# EasyEDA Pro project EtherCAT-RK3506.epro, schematic RK3506, sheets 6 to 10 of 12

## Sheets
6 RS232 RS485 CAN: Create Date: 2026-10-24; Page Name: RS232 RS485 CAN; Schematic Name: RK3506; Update Date: 2026-10-27
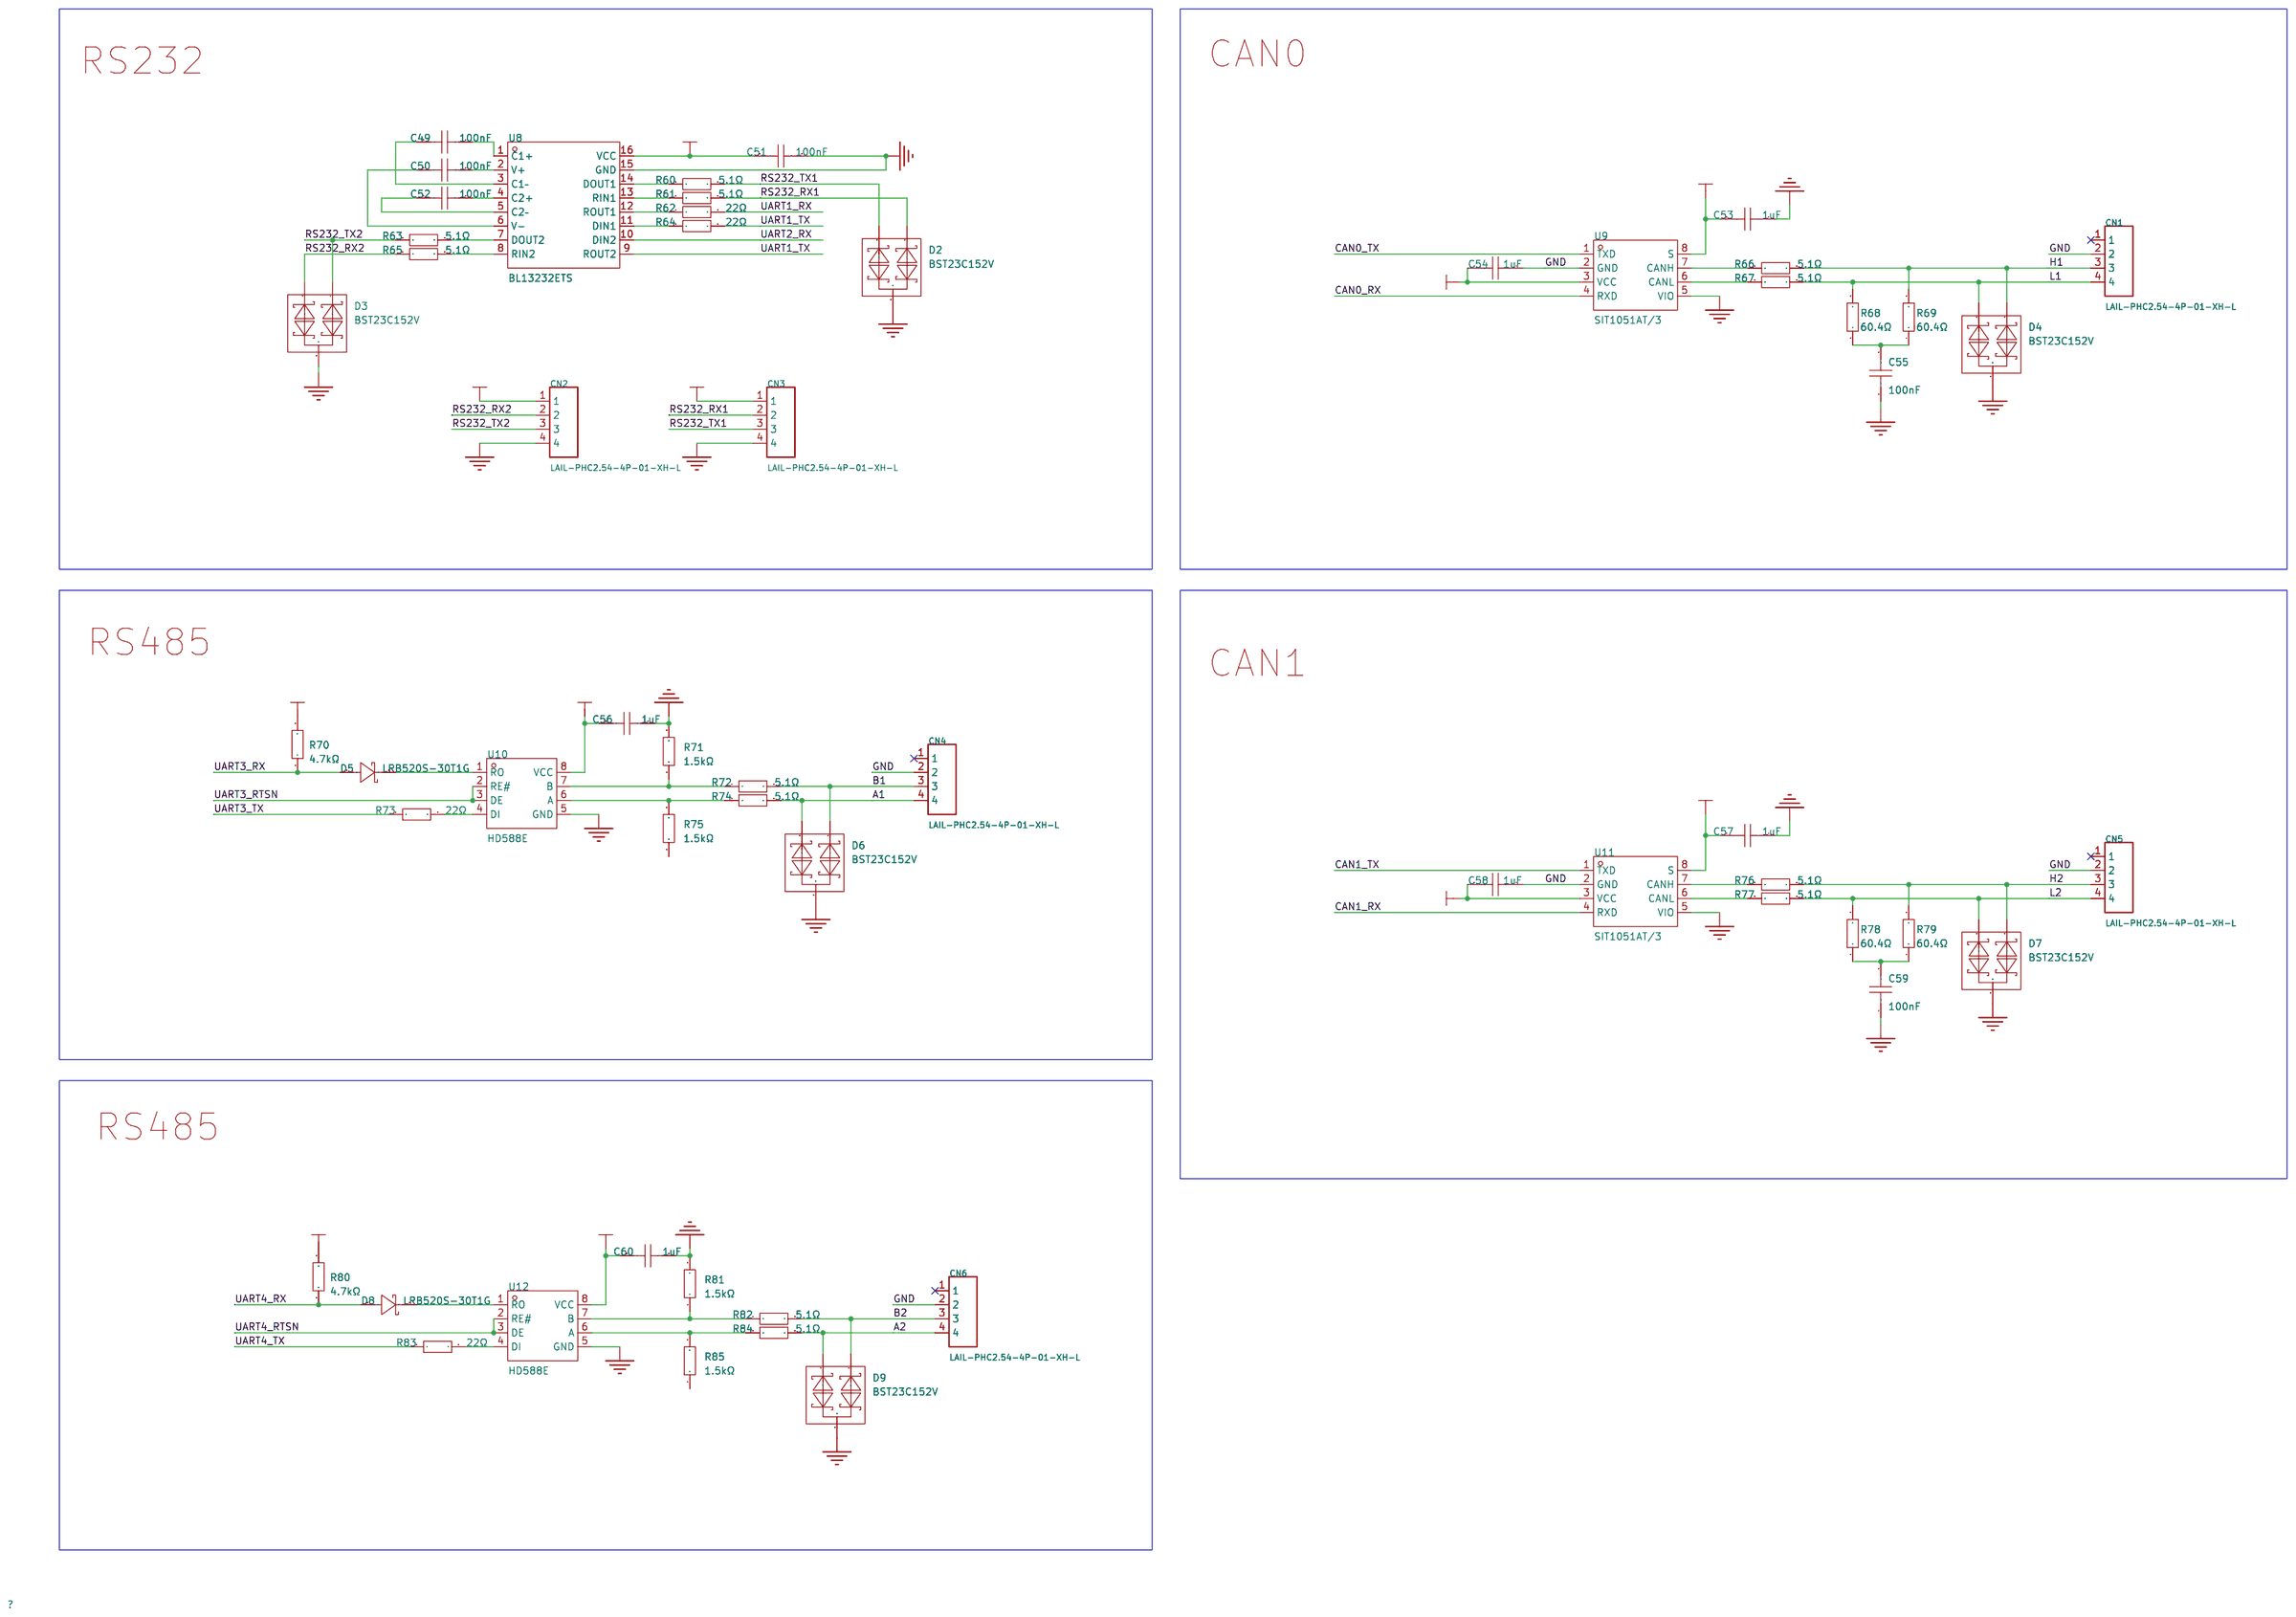
[diagram p5: RS232 RS485 CAN]
7 MIPI LCD: Create Date: 2026-10-25; Page Name: MIPI LCD; Schematic Name: RK3506; Update Date: 2026-10-26
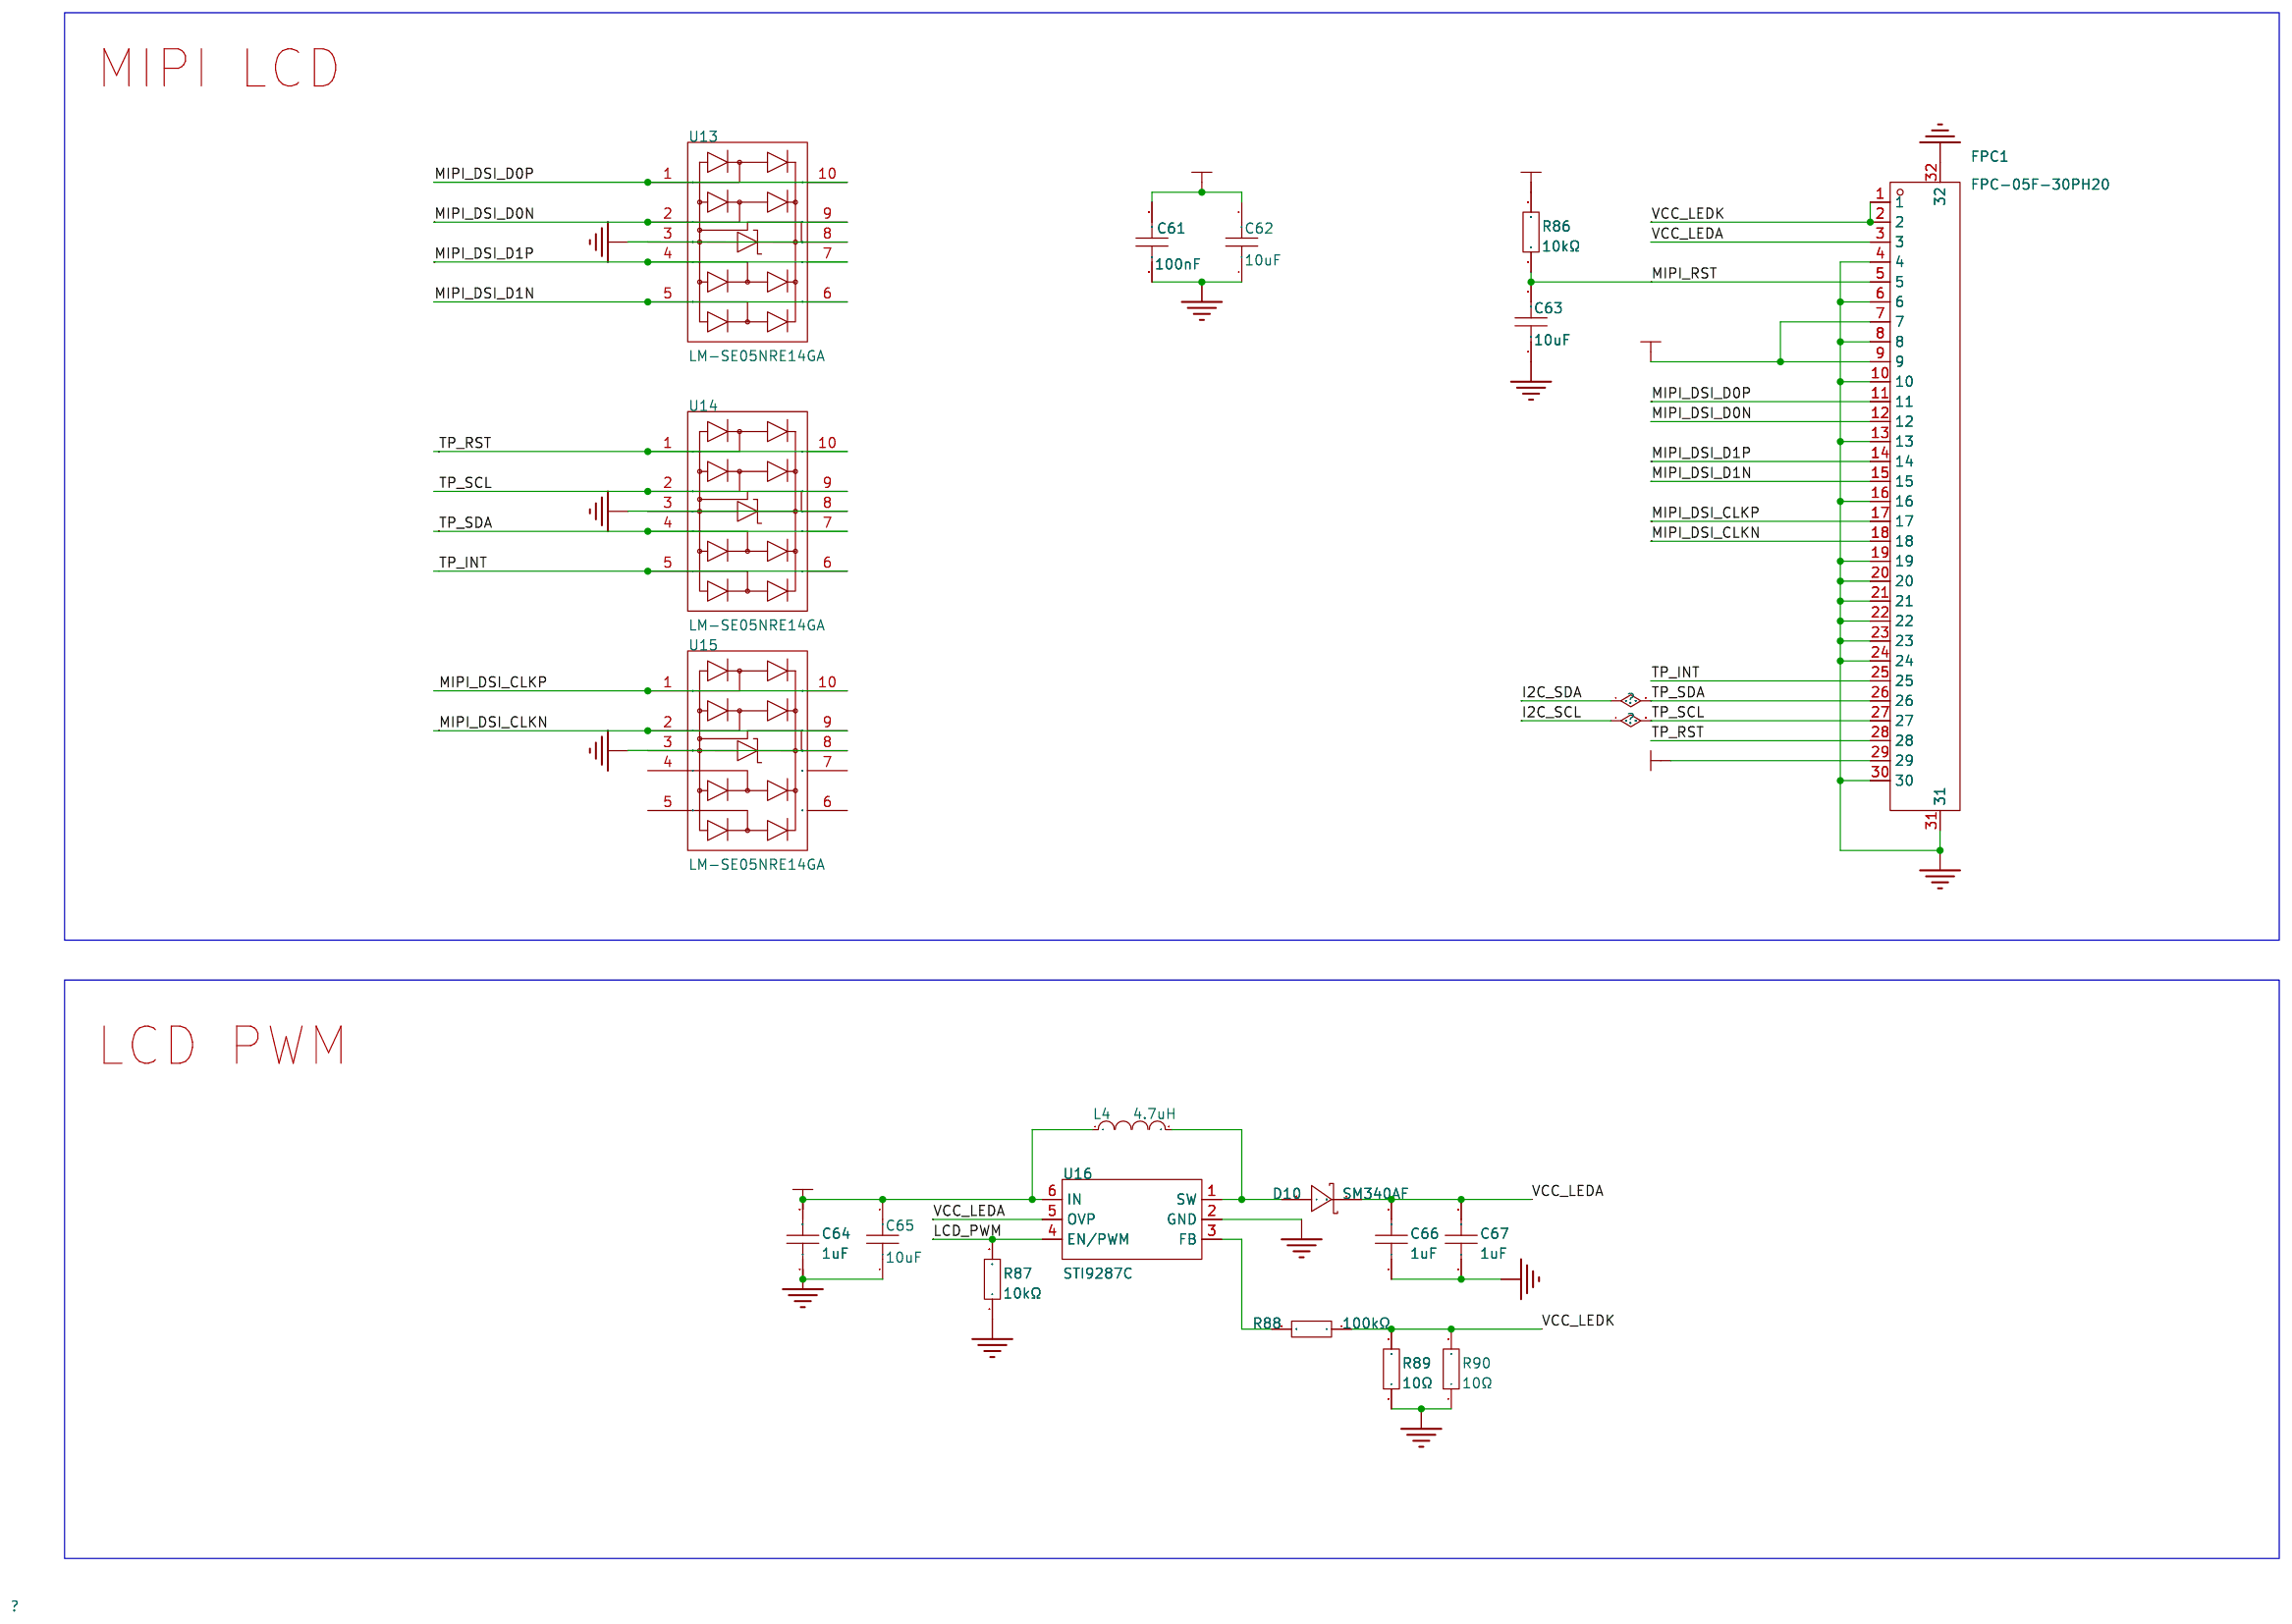
[diagram p6: MIPI LCD]
8 USB HUB: Create Date: 2026-10-25; Page Name: USB HUB; Schematic Name: RK3506; Update Date: 2026-10-28
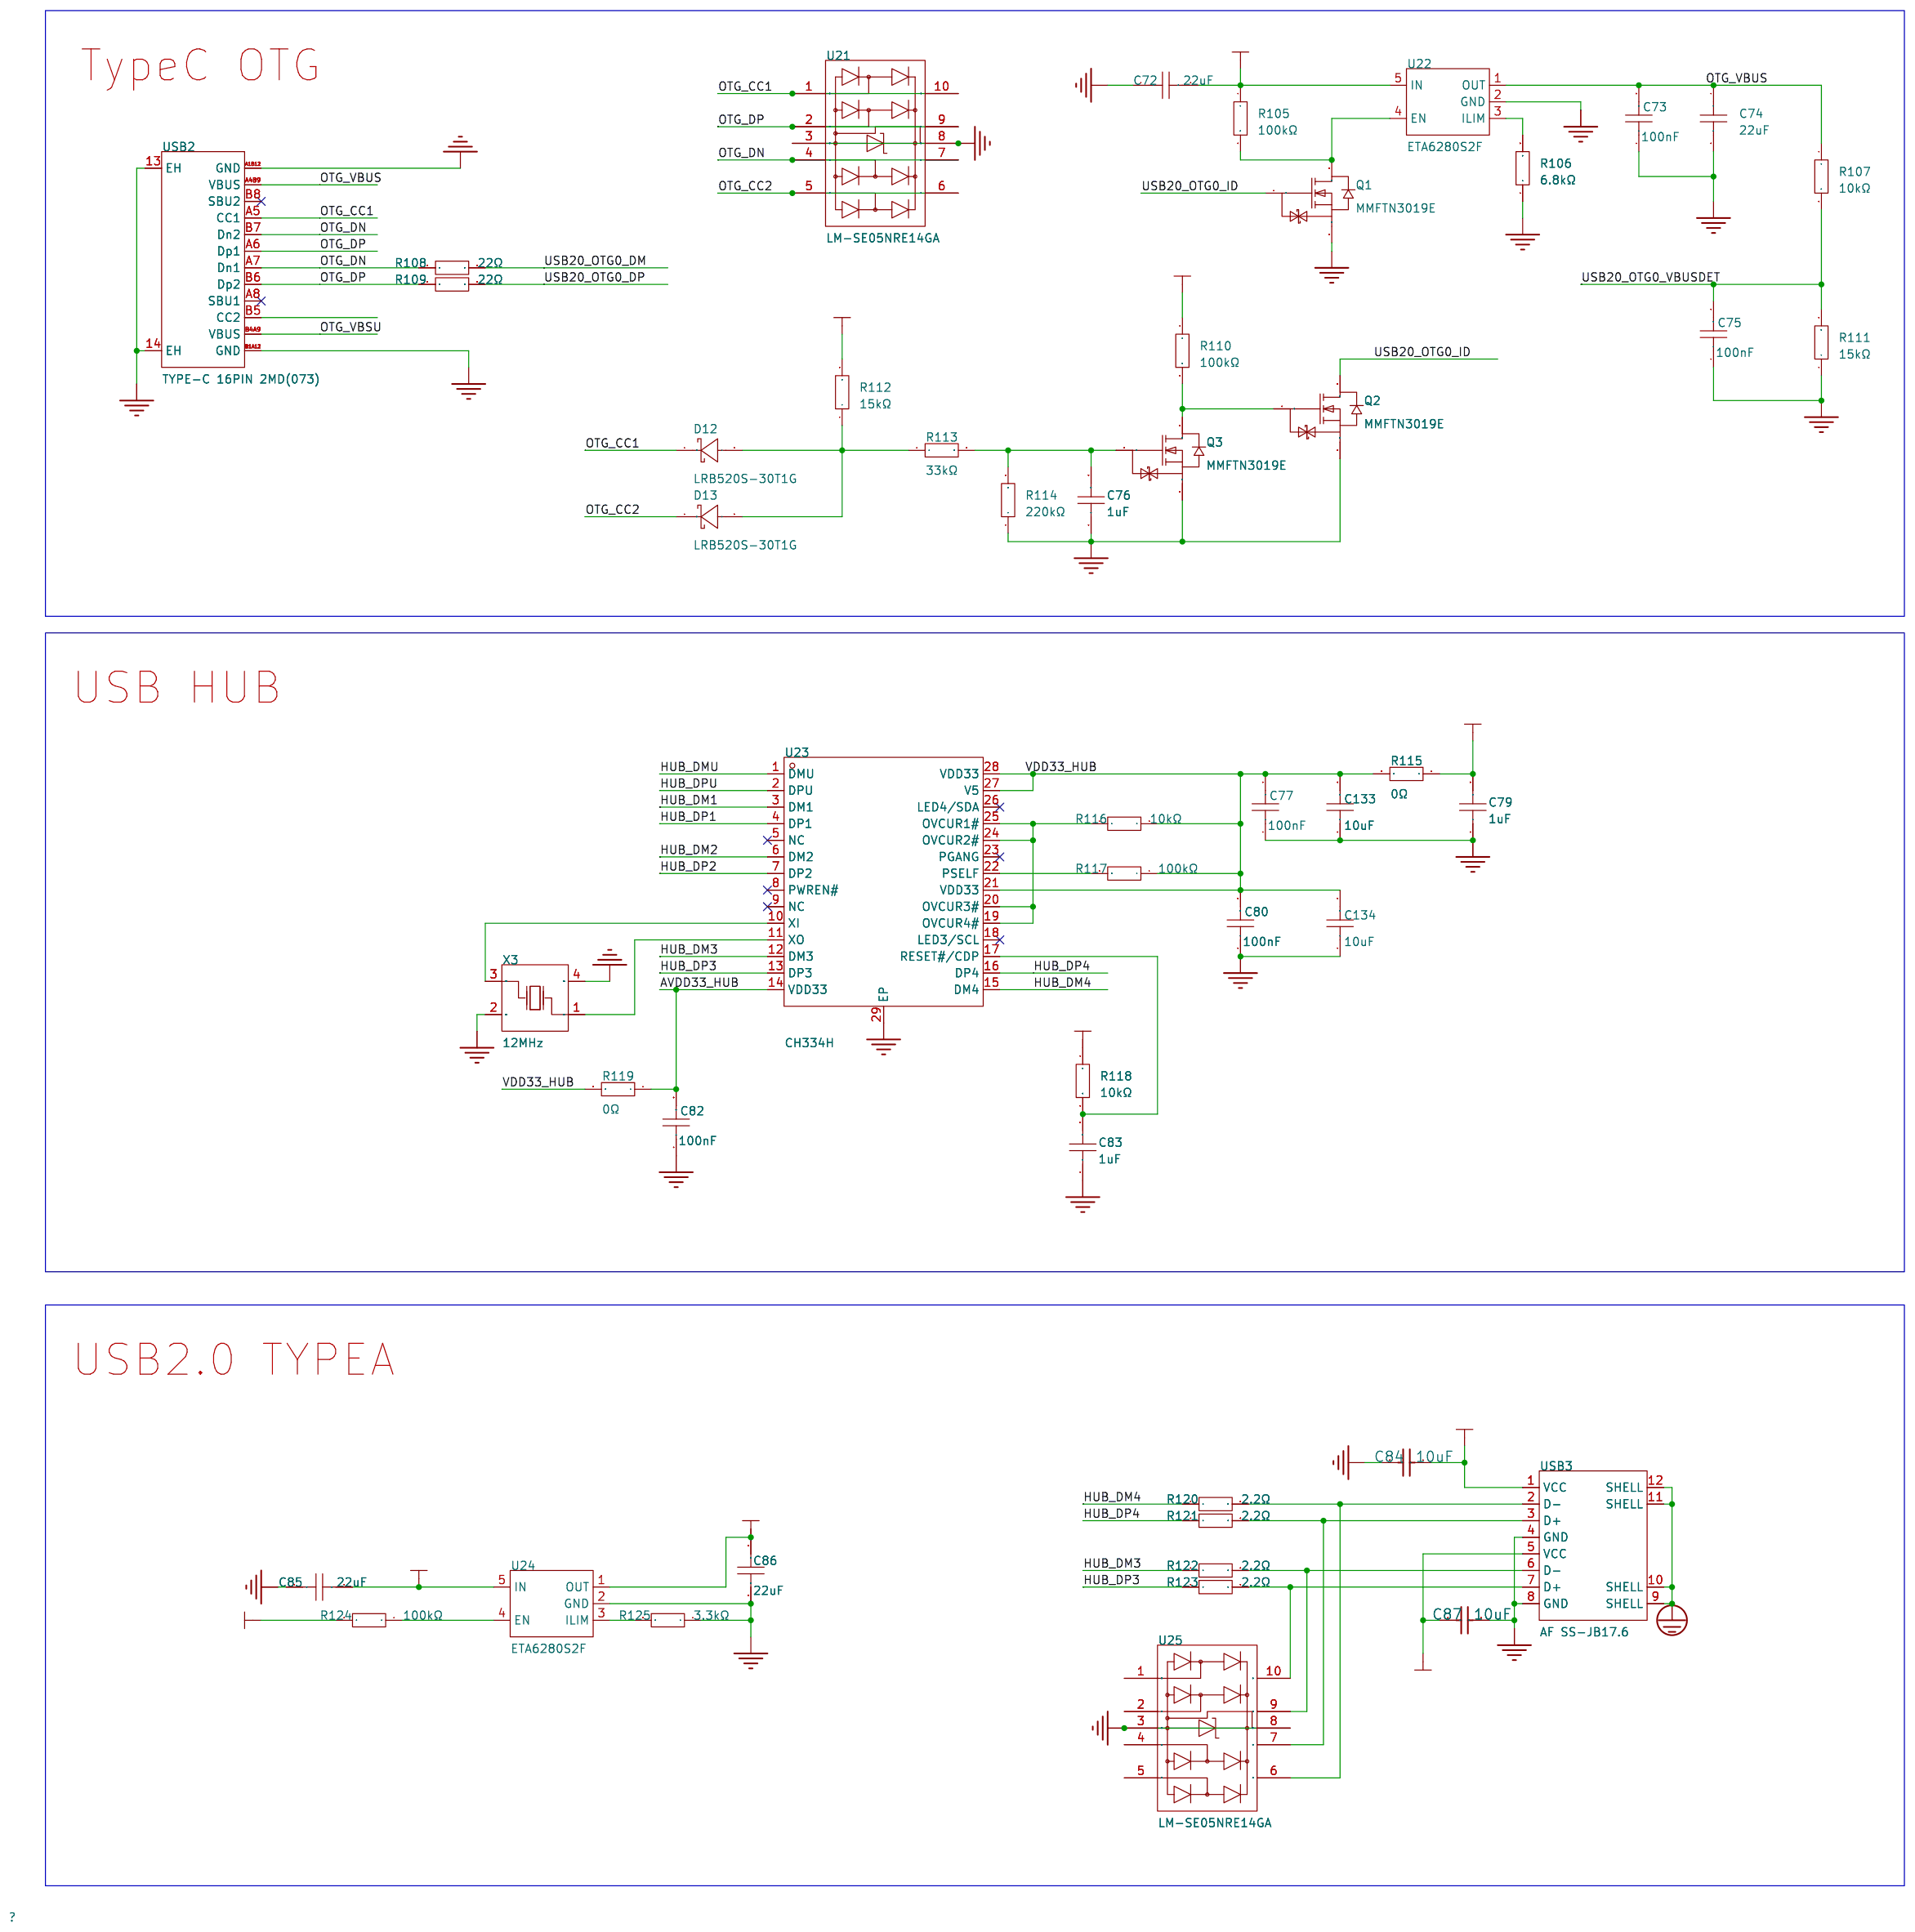
[diagram p7: USB HUB]
9 GPIO: Create Date: 2026-10-26; Page Name: GPIO; Schematic Name: RK3506; Update Date: 2026-10-27
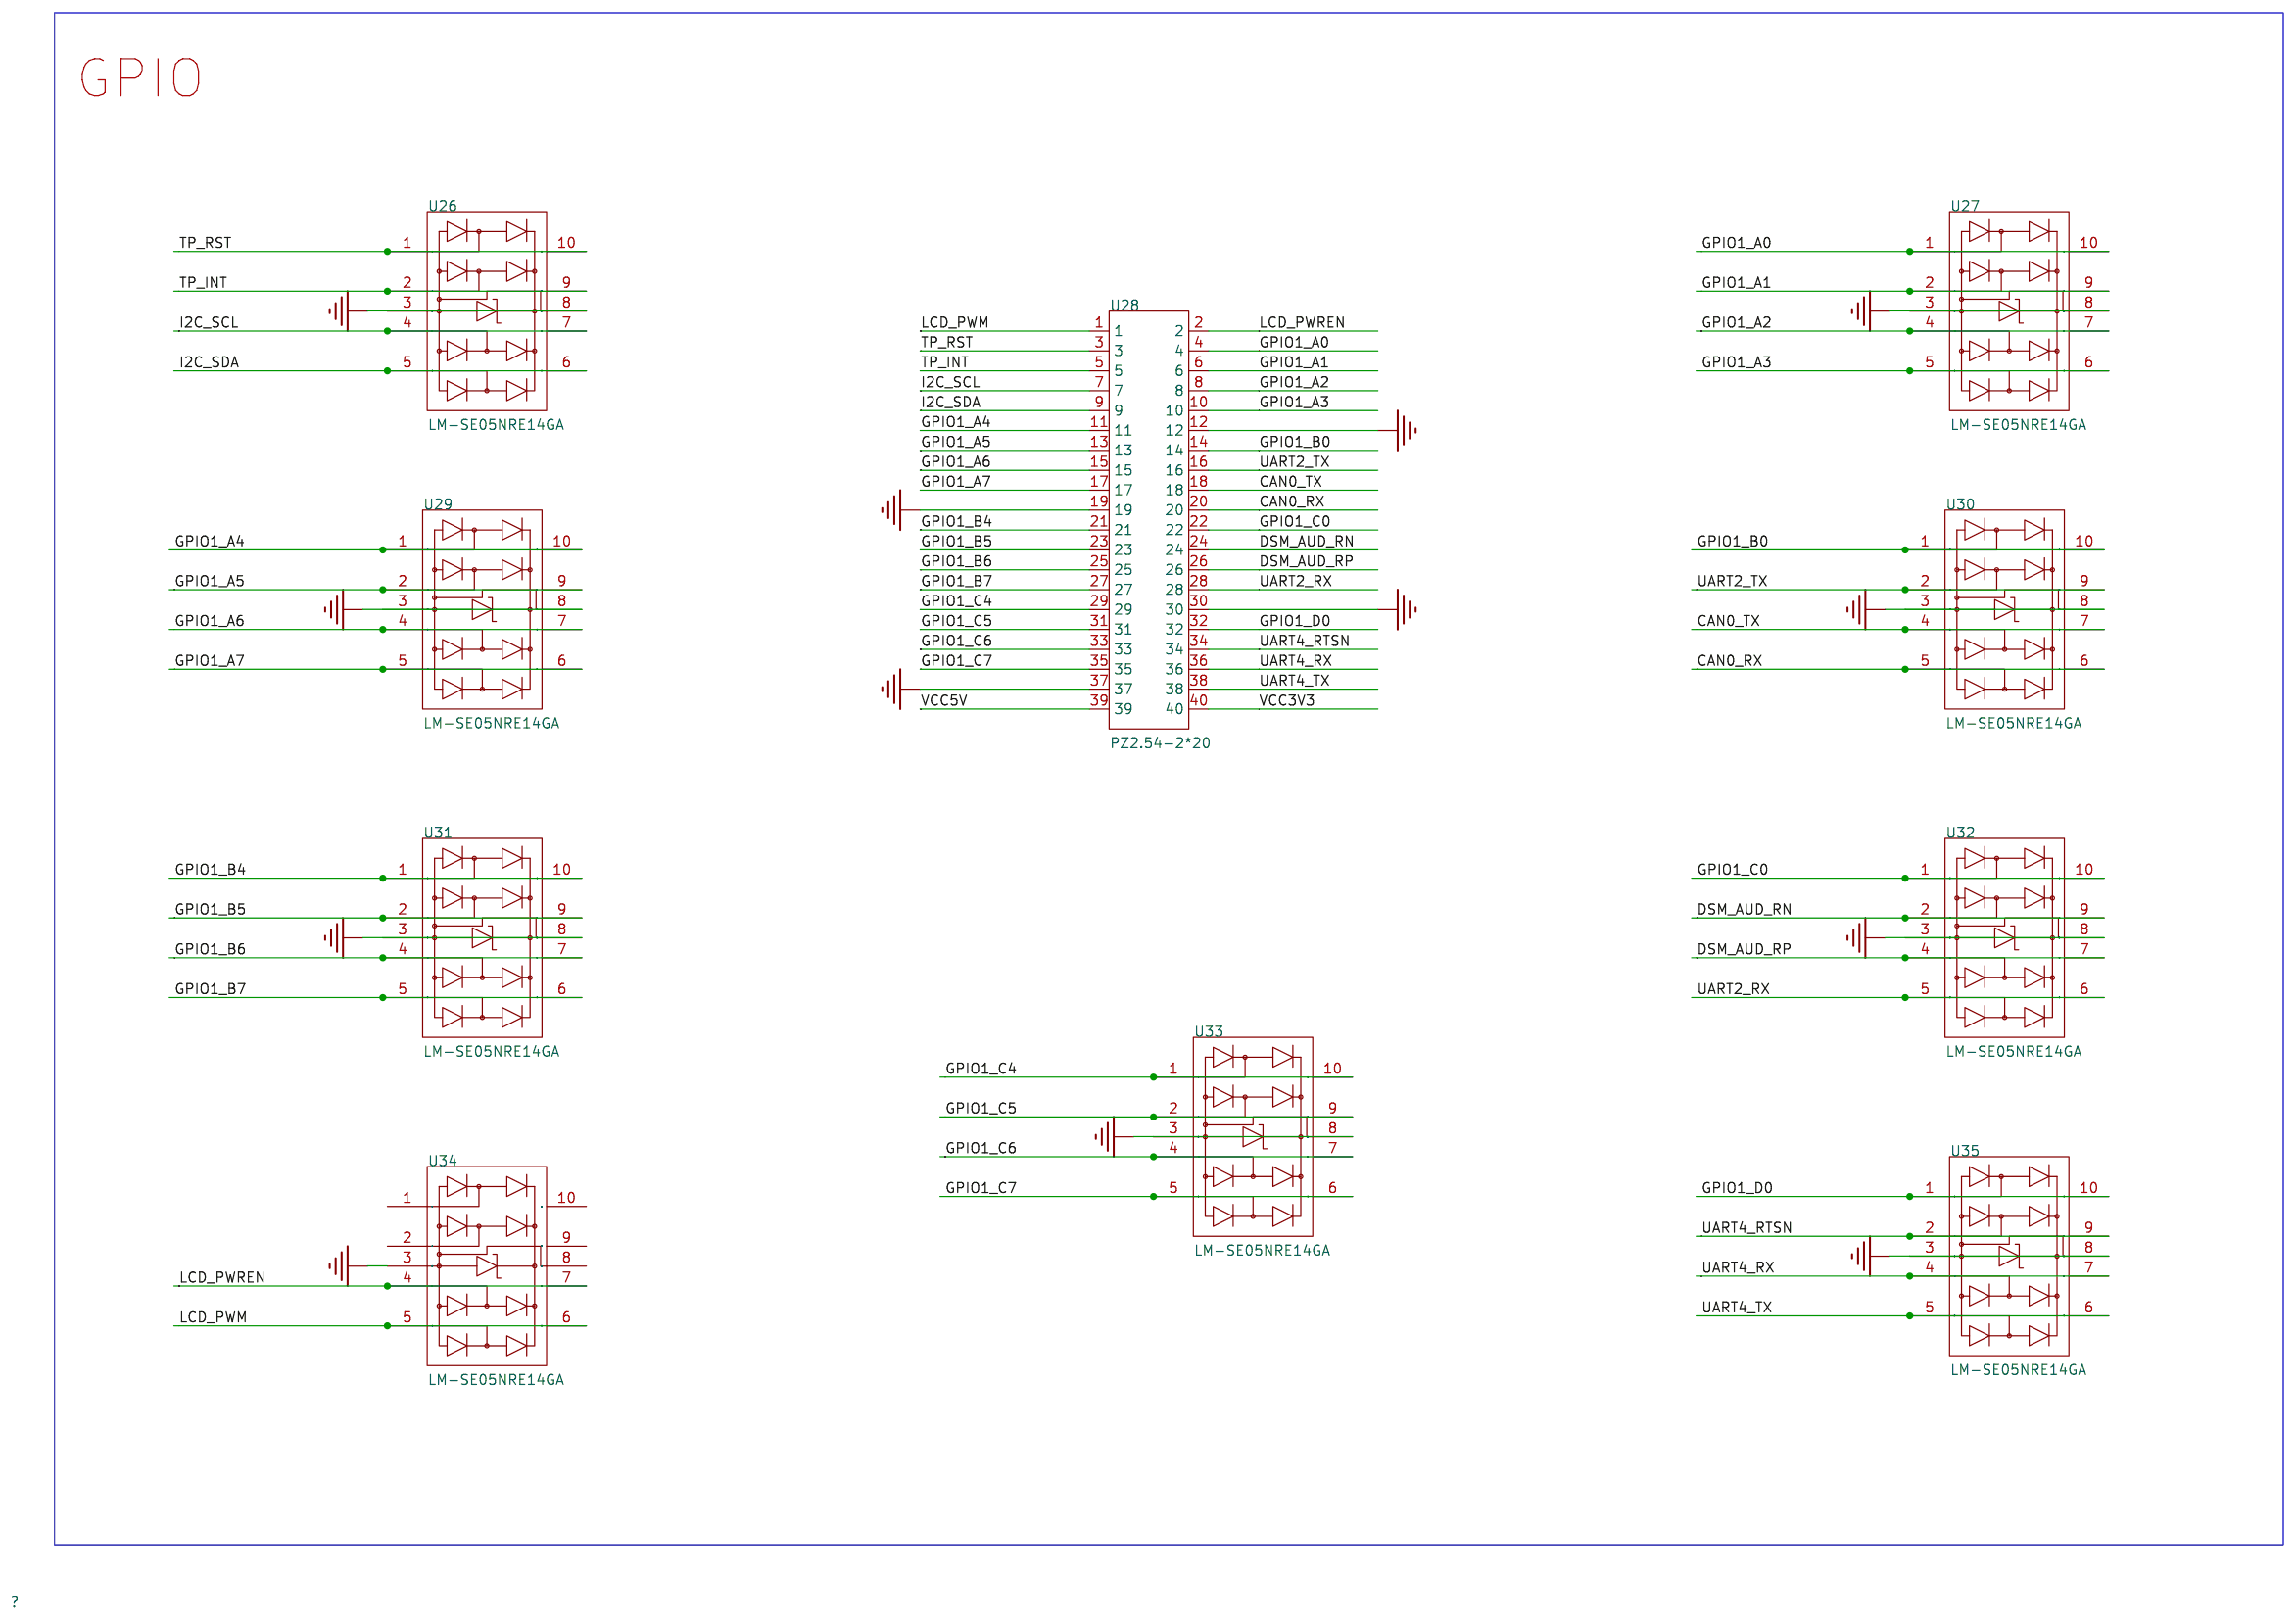
[diagram p8: GPIO]
10 Audio: Create Date: 2026-10-26; Page Name: Audio; Schematic Name: RK3506; Update Date: 2026-10-27
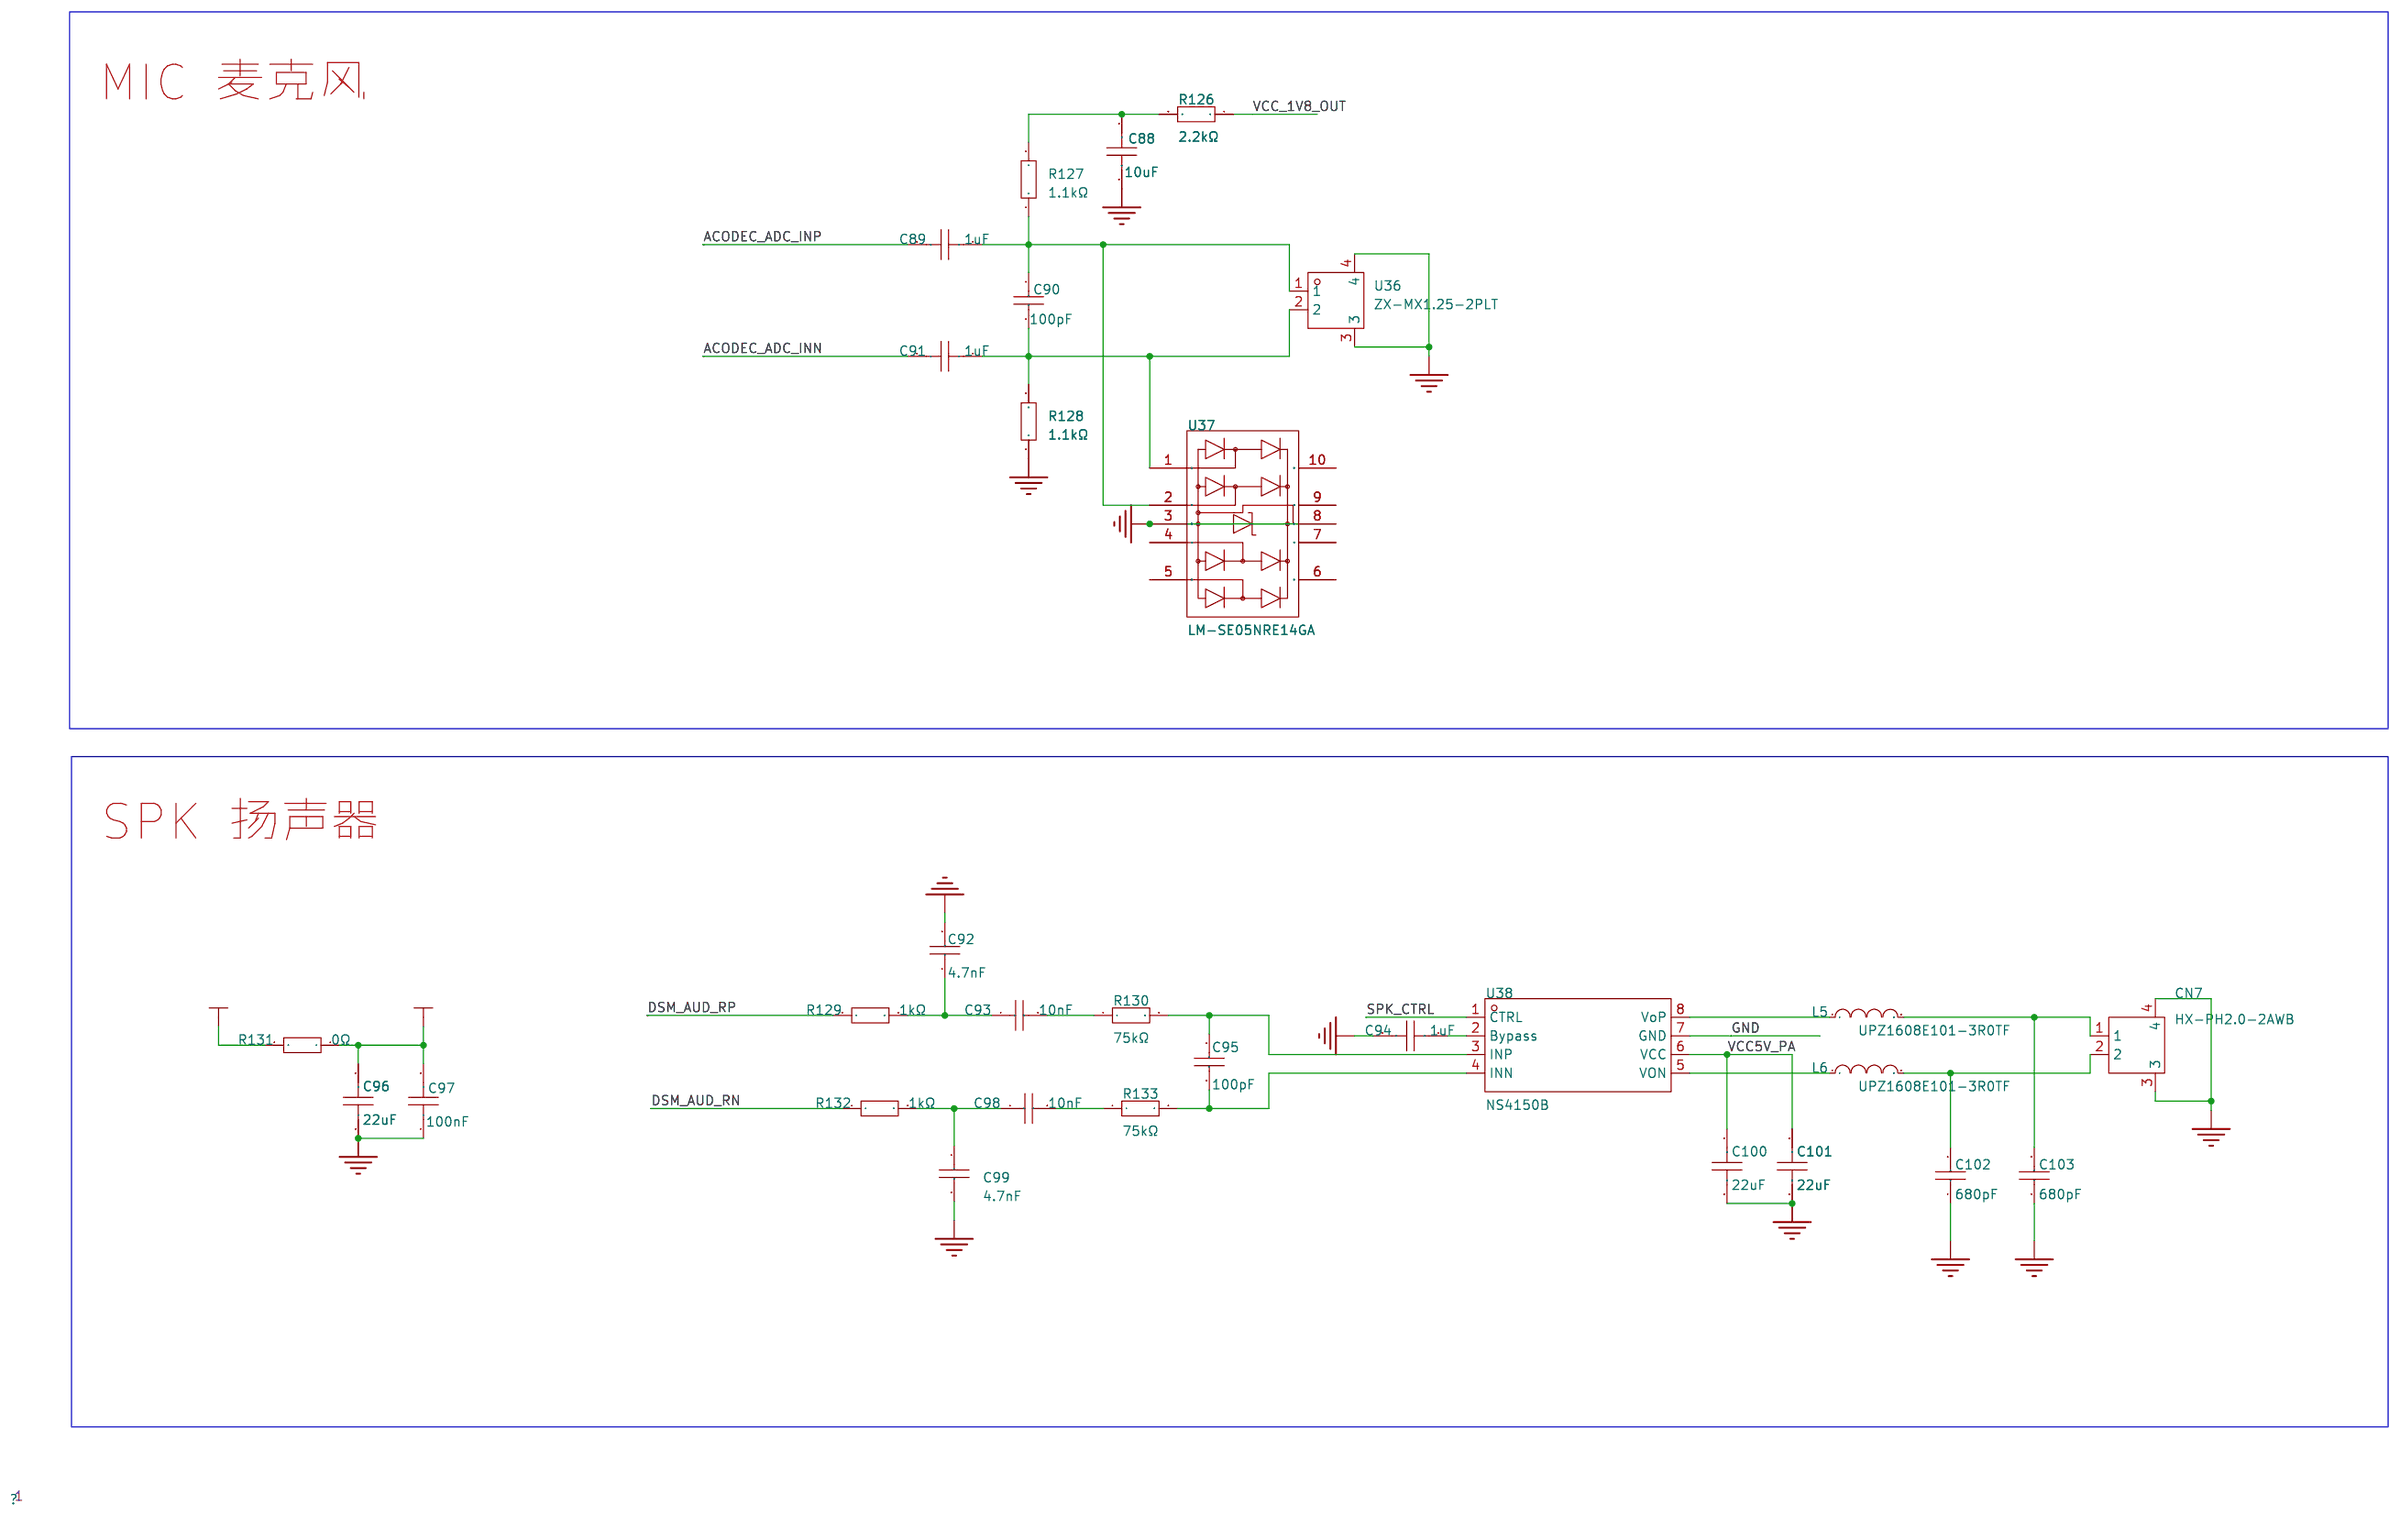
[diagram p9: Audio]

## Parts
sheet Audio
C88  10uF  [C1206]
C89  1uF  [C0402]
C90  100pF  [C0402]
C91  1uF  [C0402]
C92  4.7nF  [C0402]
C93  10nF  [C0402]
C94  1uF  [C0402]
C95  100pF  [C0402]
C96  22uF  [C0402]
C97  100nF  [C0402]
C98  10nF  [C0402]
C99  4.7nF  [C0402]
C100  22uF  [C0402]
C101  22uF  [C0402]
C102  680pF  [C0402]
C103  680pF  [C0402]
CN7  HX-PH2.0-2AWB  [CONN-SMD_2P-P2.00_HX-PH2.0-2AWB]
L5  UPZ1608E101-3R0TF  [L0603]
L6  UPZ1608E101-3R0TF  [L0603]
R126  2.2kΩ  [R0402]
R127  1.1kΩ  [R0402]
R128  1.1kΩ  [R0402]
R129  1kΩ  [R0402]
R130  75kΩ  [R0603]
R131  0Ω  [R0402]
R132  1kΩ  [R0402]
R133  75kΩ  [R0603]
U36  ZX-MX1.25-2PLT  [CONN-SMD_2P-P1.25-MX1.25-2P-LT]
U37  LM-SE05NRE14GA  [DFN2510-10_L2.5-W1.0-P0.50-BL]
U38  NS4150B  [MSOP-8_L3.0-W3.0-P0.65-LS5.0-BL]
sheet GPIO
U26  LM-SE05NRE14GA  [DFN2510-10_L2.5-W1.0-P0.50-BL]
U27  LM-SE05NRE14GA  [DFN2510-10_L2.5-W1.0-P0.50-BL]
U28  PZ2.54-2*20  [HDR-TH_40P-P2.54-V-M-R2-C20-S2.54]
U29  LM-SE05NRE14GA  [DFN2510-10_L2.5-W1.0-P0.50-BL]
U30  LM-SE05NRE14GA  [DFN2510-10_L2.5-W1.0-P0.50-BL]
U31  LM-SE05NRE14GA  [DFN2510-10_L2.5-W1.0-P0.50-BL]
U32  LM-SE05NRE14GA  [DFN2510-10_L2.5-W1.0-P0.50-BL]
U33  LM-SE05NRE14GA  [DFN2510-10_L2.5-W1.0-P0.50-BL]
U34  LM-SE05NRE14GA  [DFN2510-10_L2.5-W1.0-P0.50-BL]
U35  LM-SE05NRE14GA  [DFN2510-10_L2.5-W1.0-P0.50-BL]
sheet MIPI LCD
C61  100nF  [C0402]
C62  10uF  [C0603]
C63  10uF  [C0603]
C64  1uF  [C0402]
C65  10uF  [C0603]
C66  1uF  [C0402]
C67  1uF  [C0402]
D10  SM340AF  [SMA-FL_L3.5-W2.5-LS4.6-L-RD]
FPC1  FPC-05F-30PH20  [FPC-SMD_30P-P0.50_XUNPU_FPC-05F-30PH20]
L4  4.7uH  [IND-SMD_L2.5-W2.5]
R86  10kΩ  [R0402]
R87  10kΩ  [R0402]
R88  100kΩ  [R0402]
R89  10Ω  [R0603]
R90  10Ω  [R0603]
U13  LM-SE05NRE14GA  [DFN2510-10_L2.5-W1.0-P0.50-BL]
U14  LM-SE05NRE14GA  [DFN2510-10_L2.5-W1.0-P0.50-BL]
U15  LM-SE05NRE14GA  [DFN2510-10_L2.5-W1.0-P0.50-BL]
U16  STI9287C  [SOT-23-6_L2.9-W1.6-P0.95-LS2.8-BL]
sheet RS232 RS485 CAN
C49  100nF  [C0402]
C50  100nF  [C0402]
C51  100nF  [C0402]
C52  100nF  [C0402]
C53  1uF  [C0402]
C54  1uF  [C0402]
C55  100nF  [C0402]
C56  1uF  [C0402]
C57  1uF  [C0402]
C58  1uF  [C0402]
C59  100nF  [C0402]
C60  1uF  [C0402]
CN1  LAIL-PHC2.54-4P-01-XH-L  [CONN-TH_LAIL-PHC2.54-4P-01-XH-L]
CN2  LAIL-PHC2.54-4P-01-XH-L  [CONN-TH_LAIL-PHC2.54-4P-01-XH-L]
CN3  LAIL-PHC2.54-4P-01-XH-L  [CONN-TH_LAIL-PHC2.54-4P-01-XH-L]
CN4  LAIL-PHC2.54-4P-01-XH-L  [CONN-TH_LAIL-PHC2.54-4P-01-XH-L]
CN5  LAIL-PHC2.54-4P-01-XH-L  [CONN-TH_LAIL-PHC2.54-4P-01-XH-L]
CN6  LAIL-PHC2.54-4P-01-XH-L  [CONN-TH_LAIL-PHC2.54-4P-01-XH-L]
D2  BST23C152V  [SOT-23-3_L3.0-W1.7-P0.95-LS2.9-BR]
D3  BST23C152V  [SOT-23-3_L3.0-W1.7-P0.95-LS2.9-BR]
D4  BST23C152V  [SOT-23-3_L3.0-W1.7-P0.95-LS2.9-BR]
D5  LRB520S-30T1G  [SOD-523_L1.2-W0.8-LS1.6-RD-2]
D6  BST23C152V  [SOT-23-3_L3.0-W1.7-P0.95-LS2.9-BR]
D7  BST23C152V  [SOT-23-3_L3.0-W1.7-P0.95-LS2.9-BR]
D8  LRB520S-30T1G  [SOD-523_L1.2-W0.8-LS1.6-RD-2]
D9  BST23C152V  [SOT-23-3_L3.0-W1.7-P0.95-LS2.9-BR]
R60  5.1Ω  [R0603]
R61  5.1Ω  [R0603]
R62  22Ω  [R0402]
R63  5.1Ω  [R0603]
R64  22Ω  [R0402]
R65  5.1Ω  [R0603]
R66  5.1Ω  [R0603]
R67  5.1Ω  [R0603]
R68  60.4Ω  [R0402]
R69  60.4Ω  [R0402]
R70  4.7kΩ  [R0402]
R71  1.5kΩ  [R0402]
R72  5.1Ω  [R0603]
R73  22Ω  [R0402]
R74  5.1Ω  [R0603]
R75  1.5kΩ  [R0402]
R76  5.1Ω  [R0603]
R77  5.1Ω  [R0603]
R78  60.4Ω  [R0402]
R79  60.4Ω  [R0402]
R80  4.7kΩ  [R0402]
R81  1.5kΩ  [R0402]
R82  5.1Ω  [R0603]
R83  22Ω  [R0402]
R84  5.1Ω  [R0603]
R85  1.5kΩ  [R0402]
U8  BL13232ETS  [TSSOP-16_L5.0-W4.4-P0.65-LS6.4-BL]
U9  SIT1051AT/3  [SOP-8_L4.9-W3.9-P1.27-LS6.0-BL]
U10  HD588E  [SOP-8_L4.9-W3.9-P1.27-LS6.0-BL]
U11  SIT1051AT/3  [SOP-8_L4.9-W3.9-P1.27-LS6.0-BL]
U12  HD588E  [SOP-8_L4.9-W3.9-P1.27-LS6.0-BL]
sheet USB HUB
C72  22uF  [C0603]
C73  100nF  [C0402]
C74  22uF  [C0603]
C75  100nF  [C0402]
C76  1uF  [C0402]
C77  100nF  [C0402]
C79  1uF  [C0402]
C80  100nF  [C0402]
C82  100nF  [C0402]
C83  1uF  [C0402]
C84  10uF  [C1206]
C85  22uF  [C0603]
C86  22uF  [C0603]
C87  10uF  [C1206]
C133  10uF  [C0805]
C134  10uF  [C0805]
D12  LRB520S-30T1G  [SOD-523_L1.2-W0.8-LS1.6-RD-2]
D13  LRB520S-30T1G  [SOD-523_L1.2-W0.8-LS1.6-RD-2]
Q1  MMFTN3019E  [SOT-523-3_L1.6-W0.8-P1.00-LS1.6-BR]
Q2  MMFTN3019E  [SOT-523-3_L1.6-W0.8-P1.00-LS1.6-BR]
Q3  MMFTN3019E  [SOT-523-3_L1.6-W0.8-P1.00-LS1.6-BR]
R105  100kΩ  [R0402]
R106  6.8kΩ  [R0603]
R107  10kΩ  [R0402]
R108  22Ω  [R0402]
R109  22Ω  [R0402]
R110  100kΩ  [R0402]
R111  15kΩ  [R0402]
R112  15kΩ  [R0402]
R113  33kΩ  [R0402]
R114  220kΩ  [R0603]
R115  0Ω  [R0402]
R116  10kΩ  [R0402]
R117  100kΩ  [R0402]
R118  10kΩ  [R0402]
R119  0Ω  [R0402]
R120  2.2Ω  [R0603]
R121  2.2Ω  [R0603]
R122  2.2Ω  [R0603]
R123  2.2Ω  [R0603]
R124  100kΩ  [R0402]
R125  3.3kΩ  [R0402]
U21  LM-SE05NRE14GA  [DFN2510-10_L2.5-W1.0-P0.50-BL]
U22  ETA6280S2F  [SOT-23-5_L3.0-W1.5-P0.95-LS2.8-BL]
U23  CH334H  [QFN-28_L5.0-W5.0-P0.50-BL-EP]
U24  ETA6280S2F  [SOT-23-5_L3.0-W1.5-P0.95-LS2.8-BL]
U25  LM-SE05NRE14GA  [DFN2510-10_L2.5-W1.0-P0.50-BL]
USB2  TYPE-C 16PIN 2MD(073)  [USB-C-SMD_TYPE-C-16PIN-2MD-073]
USB3  AF SS-JB17.6  [USB-A-TH_AF-SS-JB17.6]
X3  12MHz  [CRYSTAL-SMD_4P-L3.2-W2.5-BL]

## Library data of the parts
C88 = FCC1206X106K500HT: 容值:10uF;精度:±10%;额定电压:50V;温度系数:X5R;; LCSC Part Name: 10uF ±10% 50V; Supplier Part: C7467044; Manufacturer: FOJAN(富捷); Supplier Footprint: 1206; JLCPCB Part Class: 扩展库; Datasheet: https://item.szlcsc.com/datasheet/FCC1206X106K500HT/8513631.html; Supplier: LCSC; Tolerance: ±10%; Voltage Rating: 50V; Temperature Coefficient: X5R; Operating Temperature: -55℃~+85℃
C53 C54 C56-C58 C60 C64 C66 C67 C76 C79 C83 C89 C91 C94 = CL05A105KA5NQNC: 容值:1uF;精度:±10%;额定电压:25V;温度系数:X5R;; LCSC Part Name: 1uF ±10% 25V; Supplier Part: C52923; Manufacturer: SAMSUNG(三星); Supplier Footprint: 0402; JLCPCB Part Class: 基础库; Datasheet: https://item.szlcsc.com/datasheet/CL05A105KA5NQNC/53938.html; Supplier: LCSC; Tolerance: ±10%; Voltage Rating: 25V; Temperature Coefficient: X5R
C90 C95 = 0402CG101J500NT: 容值:100pF;精度:±5%;额定电压:50V;温度系数:C0G;; LCSC Part Name: 100pF ±5% 50V; Supplier Part: C1546; Manufacturer: FH(风华); Supplier Footprint: 0402; JLCPCB Part Class: 基础库; Datasheet: https://item.szlcsc.com/datasheet/0402CG101J500NT/1898.html; Supplier: LCSC; Tolerance: ±5%; Voltage Rating: 50V; Temperature Coefficient: C0G
C92 C99 = 0402B472K500NT: 容值:4.7nF;精度:±10%;额定电压:50V;温度系数:X7R;; LCSC Part Name: 4.7nF ±10% 50V; Supplier Part: C1538; Manufacturer: FH(风华); Supplier Footprint: 0402; JLCPCB Part Class: 基础库; Datasheet: https://item.szlcsc.com/datasheet/0402B472K500NT/1890.html; Supplier: LCSC; Tolerance: ±10%; Voltage Rating: 50V; Temperature Coefficient: X7R
C93 C98 = CL05B103KB5NNNC: 容值:10nF;精度:±10%;额定电压:50V;温度系数:X7R;; LCSC Part Name: 10nF ±10% 50V; Supplier Part: C15195; Manufacturer: SAMSUNG(三星); Supplier Footprint: 0402; JLCPCB Part Class: 基础库; Datasheet: https://item.szlcsc.com/datasheet/CL05B103KB5NNNC/15869.html; Supplier: LCSC; Tolerance: ±10%; Voltage Rating: 50V; Temperature Coefficient: X7R
C96 C100 C101 = HGC0402R5226M100NTEJ: 容值:22uF;精度:±20%;额定电压:10V;温度系数:X5R;; LCSC Part Name: 22uF ±20% 10V; Supplier Part: C22367823; Manufacturer: Chinocera(华瓷); Supplier Footprint: 0402; JLCPCB Part Class: 扩展库; Datasheet: https://item.szlcsc.com/datasheet/HGC0402R5226M100NTEJ/23841128.html; Supplier: LCSC; Tolerance: ±20%; Voltage Rating: 10V; Temperature Coefficient: X5R
C49-C52 C55 C59 C61 C73 C75 C77 C80 C82 C97 = FCC0402B104K160AT: 容值:100nF;精度:±10%;额定电压:16V;温度系数:X7R;; LCSC Part Name: 100nF ±10% 16V; Supplier Part: C5137468; Manufacturer: FOJAN(富捷); Supplier Footprint: 0402; JLCPCB Part Class: 扩展库; Datasheet: https://item.szlcsc.com/datasheet/FCC0402B104K160AT/5746970.html; Supplier: LCSC; Tolerance: ±10%; Voltage Rating: 16V; Temperature Coefficient: X7R; Operating Temperature: -55℃~+125℃
C102 C103 = 0402B681K500NT: 容值:680pF;精度:±10%;额定电压:50V;温度系数:X7R;; LCSC Part Name: 680pF ±10% 50V; Supplier Part: C1541; Manufacturer: FH(风华); Supplier Footprint: 0402; JLCPCB Part Class: 扩展库; Datasheet: https://item.szlcsc.com/datasheet/0402B681K500NT/1893.html; Supplier: LCSC; Tolerance: ±10%; Voltage Rating: 50V; Temperature Coefficient: X7R
CN7 = HX-PH2.0-2AWB: 插针结构:1x2P;间距:2mm;安装方式:卧贴;参考系列:PH;总PIN数:2P;排数:1;每排PIN数:2;行距:-;额定电流:2A;触头材质:黄铜;触头镀层:锡;工作温度:-25℃~+70℃;; LCSC Part Name: 1x2P 间距:2mm 卧贴 系列:PH; Supplier Part: C52016426; Manufacturer: hanxia(韩下); Supplier Footprint: SMD,P=2mm,卧贴; JLCPCB Part Class: 扩展库; Datasheet: https://item.szlcsc.com/datasheet/HX-PH2.0-2AWB/54760471.html; Supplier: LCSC; Pins Structure: 1x2P; Pitch: 2mm; Mounting Type: 卧贴; Reference Series: PH; Number of Pins: 2P; Number of Rows: 1; Number of PINs Per Row: 2; Current Rating: 2A; Contact Material: 黄铜; Contact Plating: 锡; Operating Temperature: -25℃~+70℃; Voltage Rating: 125V; Plastic Material: LCP; Flame Retardant Rating: UL94V-0; Color: 米色; Z-Height of the Board: 5.6mm; X-Length of Bottom Edge on Board (Spacing Line): 8mm; Y-Width of Bottom Edge on Board: 8.7mm
L5 L6 = UPZ1608E101-3R0TF: 阻抗@频率:100Ω@100MHz;误差:±25%;直流电阻(DCR):30mΩ;; LCSC Part Name: 单路 0603磁珠 阻抗100Ω@100MHz; Supplier Part: C96995; Manufacturer: Sunlord(顺络); Supplier Footprint: 0603; JLCPCB Part Class: 扩展库; Datasheet: https://item.szlcsc.com/datasheet/UPZ1608E101-3R0TF/98200.html; Supplier: LCSC; Impedance @ Frequency: 100Ω@100MHz; Tolerance: ±25%; DC Resistance(DCR): 30mΩ; Current Rating: 3A; Number of Circuits: 1; Operating Temperature: -55℃~+125℃
R126 = 0402WGF2201TCE: 电阻类型:厚膜电阻;阻值:2.2kΩ;精度:±1%;功率:62.5mW;工作电压:50V;温度系数:±100ppm/℃;; LCSC Part Name: 厚膜电阻 2.2kΩ ±1%; Supplier Part: C25879; Manufacturer: UNI-ROYAL(厚声); Supplier Footprint: 0402; JLCPCB Part Class: 基础库; Datasheet: https://item.szlcsc.com/datasheet/0402WGF2201TCE/26622.html; Supplier: LCSC; Type: 厚膜电阻; Tolerance: ±1%; Power(Watts): 62.5mW; Voltage-Supply(Max): 50V; Temperature Coefficient: ±100ppm/℃; Operating Temperature: -55℃~+155℃
R127 R128 = 0402WGF1101TCE: 电阻类型:厚膜电阻;阻值:1.1kΩ;精度:±1%;功率:62.5mW;工作电压:50V;温度系数:±100ppm/℃;; LCSC Part Name: 厚膜电阻 1.1kΩ ±1%; Supplier Part: C25860; Manufacturer: UNI-ROYAL(厚声); Supplier Footprint: 0402; JLCPCB Part Class: 扩展库; Datasheet: https://item.szlcsc.com/datasheet/0402WGF1101TCE/26603.html; Supplier: LCSC; Type: 厚膜电阻; Tolerance: ±1%; Power(Watts): 62.5mW; Voltage-Supply(Max): 50V; Temperature Coefficient: ±100ppm/℃; Operating Temperature: -55℃~+155℃
R129 R132 = 0402WGF1001TCE: 电阻类型:厚膜电阻;阻值:1kΩ;精度:±1%;功率:62.5mW;工作电压:50V;温度系数:±100ppm/℃;; LCSC Part Name: 厚膜电阻 1kΩ ±1%; Supplier Part: C11702; Manufacturer: UNI-ROYAL(厚声); Supplier Footprint: 0402; JLCPCB Part Class: 基础库; Datasheet: https://item.szlcsc.com/datasheet/0402WGF1001TCE/12256.html; Supplier: LCSC; Type: 厚膜电阻; Tolerance: ±1%; Power(Watts): 62.5mW; Voltage-Supply(Max): 50V; Temperature Coefficient: ±100ppm/℃; Operating Temperature: -55℃~+155℃
R130 R133 = 0603WAF7502T5E: 电阻类型:厚膜电阻;阻值:75kΩ;精度:±1%;功率:100mW;工作电压:75V;温度系数:±100ppm/℃;; LCSC Part Name: 厚膜电阻 75kΩ ±1%; Supplier Part: C23242; Manufacturer: UNI-ROYAL(厚声); Supplier Footprint: 0603; JLCPCB Part Class: 基础库; Datasheet: https://item.szlcsc.com/datasheet/0603WAF7502T5E/23969.html; Supplier: LCSC; Type: 厚膜电阻; Tolerance: ±1%; Power(Watts): 100mW; Voltage-Supply(Max): 75V; Temperature Coefficient: ±100ppm/℃; Operating Temperature: -55℃~+155℃
R115 R119 R131 = RC0402JR-070RL: 电阻类型:厚膜电阻;阻值:0Ω;精度:±5%;功率:62.5mW;工作电压:50V;温度系数:-;; LCSC Part Name: 厚膜电阻 0Ω ±5% 62.5mW; Supplier Part: C60485; Manufacturer: YAGEO(国巨); Supplier Footprint: 0402; JLCPCB Part Class: 扩展库; Datasheet: https://item.szlcsc.com/datasheet/RC0402JR-070RL/61537.html; Supplier: LCSC; Type: 厚膜电阻; Tolerance: ±5%; Power(Watts): 62.5mW; Voltage-Supply(Max): 50V; Operating Temperature: -55℃~+155℃
U36 = ZX-MX1.25-2PLT: 插针结构:1x2P;间距:1.25mm;安装方式:立贴;参考系列:PicoBlade(MX 1.25);总PIN数:2P;排数:1;每排PIN数:2;行距:-;额定电流:1A;触头材质:黄铜;触头镀层:锡;工作温度:-25℃~+85℃;; LCSC Part Name: 1x2P 间距:1.25mm 立贴 系列:PicoBlade(MX 1.25); Supplier Part: C7430473; Manufacturer: Megastar(兆星); Supplier Footprint: SMD,P=1.25mm; JLCPCB Part Class: 扩展库; Datasheet: https://item.szlcsc.com/datasheet/ZX-MX1.25-2PLT/8430342.html; Supplier: LCSC; Pins Structure: 1x2P; Pitch: 1.25mm; Mounting Type: 立贴; Reference Series: PicoBlade(MX 1.25); Number of Pins: 2P; Number of Rows: 1; Number of PINs Per Row: 2; Current Rating: 1A; Contact Material: 黄铜; Contact Plating: 锡; Operating Temperature: -25℃~+85℃; Voltage Rating: 125V; Plastic Material: LCP; Supplementary Features: 辅助焊脚; Color: 米色; Z-Height of the Board: 4.7mm; X-Length of Bottom Edge on Board (Spacing Line): 7.5mm; Y-Width of Bottom Edge on Board: 4.3mm
U13-U15 U21 U25-U27 U29-U35 U37 = LM-SE05NRE14GA: 反向截止电压(Vrwm):5V;钳位电压:15V;击穿电压(VBR):6V;; LCSC Part Name: ESD 5V截止; Supplier Part: C5310700; Manufacturer: Leiditech(雷卯电子); Supplier Footprint: DFN2510-10; JLCPCB Part Class: 扩展库; Datasheet: https://item.szlcsc.com/datasheet/LM-SE05NRE14GA/6066343.html; Supplier: LCSC; Reverse Stand-Off Voltage (Vrwm): 5V; Clamping Voltage: 15V; Voltage - Breakdown: 6V; Reverse Leakage Current (Ir): 100nA; Number of Channels: 四路; level of protection: IEC 61000-4-5；IEC 61000-4-2; Type: ESD; Junction Capacitance: 0.3pF
U38 = NS4150B_C189961: 功放类型:D类功放;扬声器通道数:单声道;输出功率:3Wx1@4Ω;静态电流(Iq):4mA;; LCSC Part Name: 3.0W单声道D类音频功率放大器; Supplier Part: C189961; Manufacturer: Nsiway(纳芯威); Supplier Footprint: MSOP-8; JLCPCB Part Class: 扩展库; Datasheet: https://item.szlcsc.com/datasheet/NS4150B/207582.html; Supplier: LCSC; Class: D类功放; Speaker Channels: 单声道; Output Power: 3Wx1@4Ω; Total Harmonic Distortion + Noise (THD+N): 0.1%; Quiescent Current: 4mA; Power Supply Rejection Ratio (PSRR): -80dB; Efficiency: 88%；90%; Number of Inputs: 1对差分输入; Features: ESD保护；无滤波器架构；使能/关断功能；自动静音/免噪音开关; Voltage - Supply: 3V~5.25V; Operating Temperature: -40℃~+85℃
U28 = PZ2.54-2*20: 插针结构:2x20P;间距:2.54mm;行距:2.54mm;圆针/方针:方针;安装方式:直插;排数:双排;总PIN位数:40P;额定电流:2.5A;配合针长度:6mm;塑高:2.54mm;端接针长度:3mm;触头材质:黄铜;触头镀层:金;工作温度:-40℃~+105℃;; LCSC Part Name: 2x20P 间距:2.54mm 方针 直插; Supplier Part: C5224014; Manufacturer: ZHOURI(洲日); Supplier Footprint: 插件,P=2.54mm; JLCPCB Part Class: 扩展库; Datasheet: https://item.szlcsc.com/datasheet/PZ2.54-2*20/5925193.html; Supplier: LCSC; Pin Structure: 2x20P; Pitch: 2.54mm; Row Spacing: 2.54mm; Circluar Pins/Square Pins: 方针; Mounting Type: 直插; Number of Rows: 双排; Number of Pins: 40P; Current Rating: 2.5A; Length of Mating Pin: 6mm; Insulation Height: 2.54mm; Length of End Connection Pin: 3mm; Contact Material: 黄铜; Contact Plating: 金; Operating Temperature: -40℃~+105℃
C62 C63 C65 = CL10A106KP8NNNC: 容值:10uF;精度:±10%;额定电压:10V;温度系数:X5R;; LCSC Part Name: 10uF ±10% 10V; Supplier Part: C19702; Manufacturer: SAMSUNG(三星); Supplier Footprint: 0603; JLCPCB Part Class: 基础库; Datasheet: https://item.szlcsc.com/datasheet/CL10A106KP8NNNC/20411.html; Supplier: LCSC; Tolerance: ±10%; Voltage Rating: 10V; Temperature Coefficient: X5R
D10 = SM340AF: 正向压降(Vf):500mV;直流反向耐压(Vr):40V;整流电流:3A;; LCSC Part Name: 电压:40V 电流:3A; Supplier Part: C354996; Manufacturer: LRC(乐山无线电); Supplier Footprint: SMA-FL; JLCPCB Part Class: 扩展库; Datasheet: https://item.szlcsc.com/datasheet/SM340AF/330581.html; Supplier: LCSC; Voltage - Forward(Vf@If): 500mV; Voltage - DC Reverse(Vr): 40V; Current - Rectified: 3A; Reverse Leakage Current (Ir): 30mA; Operating Junction Temperature Range: -40℃~+150℃; Non-Repetitive Peak Forward Surge Current: 100A
FPC1 = FPC-05F-30PH20: 锁定特性:翻盖式;触点类型:下接;触点数量:30P;间距:0.5mm;安装方式:卧贴;工作温度:-25℃~+85℃;; LCSC Part Name: 翻盖式 下接 P数:30P 间距:0.5mm; Supplier Part: C2856808; Manufacturer: XUNPU(讯普); Supplier Footprint: SMD,P=0.5mm,卧贴; JLCPCB Part Class: 扩展库; Datasheet: https://item.szlcsc.com/datasheet/FPC-05F-30PH20/3056906.html; Supplier: LCSC; Locking Feature: 翻盖式; Contact Type: 下接; Number of Contacts: 30P; Pitch: 0.5mm; Mounting Type: 卧贴; FFC, FCB Thickness: 0.3mm; Height Above Board: 2mm; Contact Material: 磷青铜; Contact Plating: 锡; Operating Temperature: -25℃~+85℃; Rated Voltage (Max): 50V; Current Rating (Max): 500mA
L4 = SPH252012H4R7MT: 电感值:4.7uH;精度:±20%;额定电流:1.25A;饱和电流(Isat):1.2A;类型:-;; LCSC Part Name: 4.7uH ±20% 1.2A; Supplier Part: C98380; Manufacturer: Sunlord(顺络); Supplier Footprint: 1008; JLCPCB Part Class: 扩展库; Datasheet: https://item.szlcsc.com/datasheet/SPH252012H4R7MT/99589.html; Supplier: LCSC; Tolerance: ±20%; Current Rating: 1.25A; Current - Saturation(Isat): 1.2A; DC Resistance(DCR): 210mΩ
R86 R87 R107 R116 R118 = 0402WGF1002TCE: 电阻类型:厚膜电阻;阻值:10kΩ;精度:±1%;功率:62.5mW;工作电压:50V;温度系数:±100ppm/℃;; LCSC Part Name: 厚膜电阻 10kΩ ±1%; Supplier Part: C25744; Manufacturer: UNI-ROYAL(厚声); Supplier Footprint: 0402; JLCPCB Part Class: 基础库; Datasheet: https://item.szlcsc.com/datasheet/0402WGF1002TCE/26487.html; Supplier: LCSC; Type: 厚膜电阻; Tolerance: ±1%; Power(Watts): 62.5mW; Voltage-Supply(Max): 50V; Temperature Coefficient: ±100ppm/℃; Operating Temperature: -55℃~+155℃
R88 R105 R110 R117 R124 = 0402WGF1003TCE: 电阻类型:厚膜电阻;阻值:100kΩ;精度:±1%;功率:62.5mW;工作电压:50V;温度系数:±100ppm/℃;; LCSC Part Name: 厚膜电阻 100kΩ ±1%; Supplier Part: C25741; Manufacturer: UNI-ROYAL(厚声); Supplier Footprint: 0402; JLCPCB Part Class: 基础库; Datasheet: https://item.szlcsc.com/datasheet/0402WGF1003TCE/26484.html; Supplier: LCSC; Type: 厚膜电阻; Tolerance: ±1%; Power(Watts): 62.5mW; Voltage-Supply(Max): 50V; Temperature Coefficient: ±100ppm/℃; Operating Temperature: -55℃~+155℃
R89 R90 = 0603WAF100JT5E: 电阻类型:厚膜电阻;阻值:10Ω;精度:±1%;功率:100mW;工作电压:75V;温度系数:±400ppm/℃;; LCSC Part Name: 10Ω ±1% 100mW 厚膜电阻; Supplier Part: C22859; Manufacturer: UNI-ROYAL(厚声); Supplier Footprint: 0603; JLCPCB Part Class: 基础库; Datasheet: https://item.szlcsc.com/datasheet/0603WAF100JT5E/23586.html; Supplier: LCSC; Type: 厚膜电阻; Tolerance: ±1%; Power(Watts): 100mW; Voltage-Supply(Max): 75V; Temperature Coefficient: ±400ppm/℃; Operating Temperature: -55℃~+155℃
U16 = STI9287C: 类型:DC-DC;工作电压(DC):2.5V~5.5V;开关频率:1MHz~1.4MHz;通道数:1;输出电压:2.5V~30V;输出电流:-;调光:PWM;拓扑结构:升压;; LCSC Part Name: 30V输出、5.5V输入、1.2MHz高效升压型白光LED驱动器; Supplier Part: C2985059; Manufacturer: TMI(拓尔微); Supplier Footprint: SOT-23-6; JLCPCB Part Class: 扩展库; Datasheet: https://item.szlcsc.com/datasheet/STI9287C/3428904.html; Supplier: LCSC; Type: DC-DC; Voltage - Input(DC): 2.5V~5.5V; Frequency - Switching: 1MHz~1.4MHz; Number of Channels: 1; Output Voltage: 2.5V~30V; Dimming: PWM; Features: 过压保护(OVP)；内置软启动；过温保护(OTP); Topology: 升压; Operating temperature: -40℃~+125℃; Switch Tube (Built-In/External): 内置
CN1-CN6 = LAIL-PHC2.54-4P-01-XH-L: 插针结构:1x4P;间距:2.54mm;安装方式:直插;参考系列:XH;总PIN数:4P;排数:1;每排PIN数:4;额定电流:3A;触头材质:黄铜;触头镀层:锡;工作温度:-25℃~+85℃;; LCSC Part Name: 1x4P 间距:2.54mm 直插 系列:XH; Supplier Part: C54905972; Manufacturer: LAILAN(莱联); Supplier Footprint: 插件,P=2.5mm; JLCPCB Part Class: 扩展库; Datasheet: https://item.szlcsc.com/datasheet/LAIL-PHC2.54-4P-01-XH-L/58431099.html; Supplier: LCSC; Pins Structure: 1x4P; Pitch: 2.54mm; Mounting Type: 直插; Reference Series: XH; Number of Pins: 4P; Number of Rows: 1; Number of PINs Per Row: 4; Current Rating: 3A; Contact Material: 黄铜; Contact Plating: 锡; Operating Temperature: -25℃~+85℃; Voltage Rating: 250V; Plastic Material: PA66; Flame Retardant Rating: UL94V-0; Color: 白色; Z-Height of the Board: 7.1mm; X-Length of Bottom Edge on Board (Spacing Line): 11mm; Y-Width of Bottom Edge on Board: 5.8mm
D2-D4 D6 D7 D9 = BST23C152V: 极性:双向;反向截止电压(Vrwm):15V;钳位电压:30V;峰值脉冲电流(Ipp):10A@8/20us;峰值脉冲功率(Ppp):250W@8/20us;; LCSC Part Name: 双向ESD 15V截止 峰值浪涌电流：10A@8/20us; Supplier Part: C151963; Manufacturer: BORN(伯恩半导体); Supplier Footprint: SOT-23; JLCPCB Part Class: 扩展库; Datasheet: https://item.szlcsc.com/datasheet/BST23C152V/163303.html; Supplier: LCSC; Polarity: 双向; Reverse Stand-Off Voltage (Vrwm): 15V; Clamping Voltage: 30V; Peak Pulse Current (Ipp): 10A@8/20us; Peak Pulse Power Dissipation (Ppp): 250W@8/20us; Reverse Leakage Current (Ir): 1uA; Number of Channels: 单路; level of protection: IEC 61000-4-4；IEC 61000-4-2; Type: ESD; Junction Capacitance: 40pF；25pF
D5 D8 D12 D13 = LRB520S-30T1G_C52204749: 二极管配置:1个独立式;正向压降(Vf):600mV@200mA;直流反向耐压(Vr):30V;整流电流:200mA;; LCSC Part Name: 肖特基势垒二极管，适用于低电流整流和高速开关，表面贴装型，采用硅外延平面结构，开关速度快、正向电压低、反向电流小; Supplier Part: C52204749; Manufacturer: LRC(乐山无线电); Supplier Footprint: SOD-523; JLCPCB Part Class: 扩展库; Datasheet: https://item.szlcsc.com/datasheet/LRB520S-30T1G/55045632.html; Supplier: LCSC; Diode Configuration: 1个独立式; Voltage - Forward(Vf@If): 600mV@200mA; Voltage - DC Reverse(Vr): 30V; Current - Rectified: 200mA; Reverse Leakage Current (Ir): 1uA@10V; Non-Repetitive Peak Forward Surge Current: 1A
R60 R61 R63 R65-R67 R72 R74 R76 R77 R82 R84 = 0603WAF510KT5E: 电阻类型:厚膜电阻;阻值:5.1Ω;精度:±1%;功率:100mW;工作电压:75V;温度系数:±200ppm/℃;; LCSC Part Name: 5.1Ω ±1% 100mW 厚膜电阻; Supplier Part: C25197; Manufacturer: UNI-ROYAL(厚声); Supplier Footprint: 0603; JLCPCB Part Class: 基础库; Datasheet: https://item.szlcsc.com/datasheet/0603WAF510KT5E/25940.html; Supplier: LCSC; Type: 厚膜电阻; Tolerance: ±1%; Power(Watts): 100mW; Voltage-Supply(Max): 75V; Temperature Coefficient: ±200ppm/℃; Operating Temperature: -55℃~+155℃
R62 R64 R73 R83 R108 R109 = 0402WGF220JTCE: 电阻类型:厚膜电阻;阻值:22Ω;精度:±1%;功率:62.5mW;最大工作电压:50V;温度系数:±100ppm/℃;; LCSC Part Name: 22Ω ±1% 62.5mW 厚膜电阻; Supplier Part: C25092; Manufacturer: UNI-ROYAL(厚声); Supplier Footprint: 0402; JLCPCB Part Class: 基础库; Datasheet: https://atta.szlcsc.com/upload/public/pdf/source/20200306/C422600_1E6D84923E4A46A82E41ADD87F860B5C.pdf; Supplier: LCSC; Type: 厚膜电阻; Tolerance: ±1%; Power(Watts): 62.5mW; Overload Voltage (Max): 50V; Temperature Coefficient: ±100ppm/℃; Operating Temperature Range: -55℃~+155℃
R68 R69 R78 R79 = RC0402FR-0760R4L: 电阻类型:厚膜电阻;阻值:60.4Ω;精度:±1%;功率:62.5mW;工作电压:50V;温度系数:±100ppm/℃;; LCSC Part Name: 厚膜电阻 60.4Ω ±1% 62.5mW; Supplier Part: C137954; Manufacturer: YAGEO(国巨); Supplier Footprint: 0402; JLCPCB Part Class: 扩展库; Datasheet: https://item.szlcsc.com/datasheet/RC0402FR-0760R4L/149270.html; Supplier: LCSC; Type: 厚膜电阻; Tolerance: ±1%; Power(Watts): 62.5mW; Voltage-Supply(Max): 50V; Temperature Coefficient: ±100ppm/℃; Operating Temperature: -55℃~+155℃
R70 R80 = 0402WGF4701TCE: 电阻类型:厚膜电阻;阻值:4.7kΩ;精度:±1%;功率:62.5mW;工作电压:50V;温度系数:±100ppm/℃;; LCSC Part Name: 厚膜电阻 4.7kΩ ±1%; Supplier Part: C25900; Manufacturer: UNI-ROYAL(厚声); Supplier Footprint: 0402; JLCPCB Part Class: 基础库; Datasheet: https://item.szlcsc.com/datasheet/0402WGF4701TCE/26643.html; Supplier: LCSC; Type: 厚膜电阻; Tolerance: ±1%; Power(Watts): 62.5mW; Voltage-Supply(Max): 50V; Temperature Coefficient: ±100ppm/℃; Operating Temperature: -55℃~+155℃
R71 R75 R81 R85 = 0402WGF1501TCE: 电阻类型:厚膜电阻;阻值:1.5kΩ;精度:±1%;功率:62.5mW;最大工作电压:50V;温度系数:±100ppm/℃;; LCSC Part Name: 1.5kΩ ±1% 62.5mW 厚膜电阻; Supplier Part: C25867; Manufacturer: UNI-ROYAL(厚声); Supplier Footprint: 0402; JLCPCB Part Class: 基础库; Datasheet: https://atta.szlcsc.com/upload/public/pdf/source/20200306/C422600_1E6D84923E4A46A82E41ADD87F860B5C.pdf; Supplier: LCSC; Type: 厚膜电阻; Tolerance: ±1%; Power(Watts): 62.5mW; Overload Voltage (Max): 50V; Temperature Coefficient: ±100ppm/℃; Operating Temperature Range: -55℃~+155℃
U8 = BL13232ETS_C5128657: 类型:收发器;数据速率:250Kbps;; LCSC Part Name: 3V至5.5V，250kbps RS-232收发器; Supplier Part: C5128657; Manufacturer: BL(上海贝岭); Supplier Footprint: TSSOP-16; JLCPCB Part Class: 扩展库; Datasheet: https://item.szlcsc.com/datasheet/BL13232ETS/5733432.html; Supplier: LCSC; Type: 收发器; Number of Drivers: 2; Number of Receivers: 2; Data Rate: 250Kbps; Voltage - Supply: 3V~5.5V; ESD Protect: ±12kV; charge pump: 有; Operating Temperature: -40℃~+125℃; Quiescent Supply Current: 1.5mA
U9 U11 = SIT1051AT/3: 类型:CAN-FD收发器;数据速率:5Mbps;; LCSC Part Name: SIT1051A CAN FD静音模式总线收发器; Supplier Part: C5382551; Manufacturer: SIT(芯力特); Supplier Footprint: SOP-8; JLCPCB Part Class: 扩展库; Datasheet: https://item.szlcsc.com/datasheet/SIT1051AT%252F3/6255025.html; Supplier: LCSC; Type: CAN-FD收发器; Data Rate: 5Mbps; Voltage - Supply: 4.5V~5.5V; Current - Supply: 70mA; Operating Temperature: -40℃~+150℃; Number of Channels: 1; Quiescent Supply Current: 1.5mA; Features: 短路保护；静默模式；热关断保护；欠压保护；集成电平移位；ESD保护；TXD占优超时；低功耗模式
U10 U12 = HD588E: 类型:收发器;数据速率:1Mbps;; LCSC Part Name: 高速、失效保护RS-485收发器; Supplier Part: C466028; Manufacturer: Broadic(展恒电子); Supplier Footprint: SOP-8; JLCPCB Part Class: 扩展库; Datasheet: https://item.szlcsc.com/datasheet/HD588E/471233.html; Supplier: LCSC; Type: 收发器; Number of Drivers: 1; Number of Receivers: 1; Voltage - Supply: 5V; Data Rate: 1Mbps; Number of Nodes: 256; ESD Protect: ±16kV; Operating Temperature: -40℃~+125℃; Quiescent Supply Current: 600uA; Communication Mode: 半双工; Features: 热关断保护；使能关断；过流保护；低功耗模式
C72 C74 C85 C86 = CL10A226MQ8NRNC: 容值:22uF;精度:±20%;额定电压:6.3V;温度系数:X5R;; LCSC Part Name: 22uF ±20% 6.3V; Supplier Part: C59461; Manufacturer: SAMSUNG(三星); Supplier Footprint: 0603; JLCPCB Part Class: 基础库; Datasheet: https://item.szlcsc.com/datasheet/CL10A226MQ8NRNC/60514.html; Supplier: LCSC; Tolerance: ±20%; Voltage Rating: 6.3V; Temperature Coefficient: X5R
C84 C87 = CL31A106KBHNNNE: 容值:10uF;精度:±10%;额定电压:50V;温度系数:X5R;; LCSC Part Name: 10uF ±10% 50V; Supplier Part: C13585; Manufacturer: SAMSUNG(三星); Supplier Footprint: 1206; JLCPCB Part Class: 基础库; Datasheet: https://item.szlcsc.com/datasheet/CL31A106KBHNNNE/14236.html; Supplier: LCSC; Tolerance: ±10%; Voltage Rating: 50V; Temperature Coefficient: X5R
C133 C134 = GRM21BR61H106KE43L: 容值:10uF;精度:±10%;额定电压:50V;温度系数:X5R;; LCSC Part Name: 10uF ±10% 50V; Supplier Part: C440198; Manufacturer: muRata(村田); Supplier Footprint: 0805; JLCPCB Part Class: 基础库; Datasheet: https://item.szlcsc.com/datasheet/GRM21BR61H106KE43L/439567.html; Supplier: LCSC; Tolerance: ±10%; Voltage Rating: 50V; Temperature Coefficient: X5R
Q1-Q3 = MMFTN3019E: 数量:1个N沟道;漏源电压(Vdss):30V;连续漏极电流(Id):100mA;导通电阻(RDS(on)):8Ω@4V;耗散功率(Pd):150mW;阈值电压(Vgs(th)):1.5V;; LCSC Part Name: 1个N沟道 耐压:30V 电流:100mA; Supplier Part: C86709; Manufacturer: ST(先科); Supplier Footprint: SOT-523-3; JLCPCB Part Class: 扩展库; Datasheet: https://item.szlcsc.com/datasheet/MMFTN3019E/87886.html; Supplier: LCSC; Number: 1个N沟道; Drain to Source Voltage: 30V; Current - Continuous Drain(Id): 100mA; RDS(on): 8Ω@4V; Pd - Power Dissipation: 150mW; Gate Threshold Voltage (Vgs(th)): 1.5V; Input Capacitance(Ciss): 13pF; Reverse Transfer Capacitance (Crss@Vds): 4pF; Type: N沟道; Output Capacitance(Coss): 9pF; Vgs: ±20V
R106 = 0603WAF6801T5E: 电阻类型:厚膜电阻;阻值:6.8kΩ;精度:±1%;功率:100mW;工作电压:75V;温度系数:±100ppm/℃;; LCSC Part Name: 厚膜电阻 6.8kΩ ±1%; Supplier Part: C23212; Manufacturer: UNI-ROYAL(厚声); Supplier Footprint: 0603; JLCPCB Part Class: 基础库; Datasheet: https://item.szlcsc.com/datasheet/0603WAF6801T5E/23939.html; Supplier: LCSC; Type: 厚膜电阻; Tolerance: ±1%; Power(Watts): 100mW; Voltage-Supply(Max): 75V; Temperature Coefficient: ±100ppm/℃; Operating Temperature: -55℃~+155℃
R111 R112 = 0402WGF1502TCE: 电阻类型:厚膜电阻;阻值:15kΩ;精度:±1%;功率:62.5mW;最大工作电压:50V;温度系数:±100ppm/℃;; LCSC Part Name: 15kΩ ±1% 62.5mW 厚膜电阻; Supplier Part: C25756; Manufacturer: UNI-ROYAL(厚声); Supplier Footprint: 0402; JLCPCB Part Class: 基础库; Datasheet: https://atta.szlcsc.com/upload/public/pdf/source/20200306/C422600_1E6D84923E4A46A82E41ADD87F860B5C.pdf; Supplier: LCSC; Type: 厚膜电阻; Tolerance: ±1%; Power(Watts): 62.5mW; Overload Voltage (Max): 50V; Temperature Coefficient: ±100ppm/℃; Operating Temperature Range: -55℃~+155℃
R113 = 0402WGF3302TCE: 电阻类型:厚膜电阻;阻值:33kΩ;精度:±1%;功率:62.5mW;最大工作电压:50V;温度系数:±100ppm/℃;; LCSC Part Name: 33kΩ ±1% 62.5mW 厚膜电阻; Supplier Part: C25779; Manufacturer: UNI-ROYAL(厚声); Supplier Footprint: 0402; JLCPCB Part Class: 基础库; Datasheet: https://atta.szlcsc.com/upload/public/pdf/source/20200306/C422600_1E6D84923E4A46A82E41ADD87F860B5C.pdf; Supplier: LCSC; Type: 厚膜电阻; Tolerance: ±1%; Power(Watts): 62.5mW; Overload Voltage (Max): 50V; Temperature Coefficient: ±100ppm/℃; Operating Temperature Range: -55℃~+155℃
R114 = 0603WAF2203T5E: 电阻类型:厚膜电阻;阻值:220kΩ;精度:±1%;功率:100mW;工作电压:75V;温度系数:±100ppm/℃;; LCSC Part Name: 220kΩ ±1% 100mW 厚膜电阻; Supplier Part: C22961; Manufacturer: UNI-ROYAL(厚声); Supplier Footprint: 0603; JLCPCB Part Class: 基础库; Datasheet: https://item.szlcsc.com/datasheet/0603WAF2203T5E/23688.html; Supplier: LCSC; Type: 厚膜电阻; Tolerance: ±1%; Power(Watts): 100mW; Voltage-Supply(Max): 75V; Temperature Coefficient: ±100ppm/℃; Operating Temperature: -55℃~+155℃
R120-R123 = 0603WAF220KT5E: 电阻类型:厚膜电阻;阻值:2.2Ω;精度:±1%;功率:100mW;工作电压:75V;温度系数:±400ppm/℃;; LCSC Part Name: 厚膜电阻 2.2Ω ±1%; Supplier Part: C22939; Manufacturer: UNI-ROYAL(厚声); Supplier Footprint: 0603; JLCPCB Part Class: 基础库; Datasheet: https://item.szlcsc.com/datasheet/0603WAF220KT5E/23666.html; Supplier: LCSC; Type: 厚膜电阻; Tolerance: ±1%; Power(Watts): 100mW; Voltage-Supply(Max): 75V; Temperature Coefficient: ±400ppm/℃; Operating Temperature: -55℃~+155℃
R125 = 0402WGF3301TCE: 电阻类型:厚膜电阻;阻值:3.3kΩ;精度:±1%;功率:62.5mW;工作电压:50V;温度系数:±100ppm/℃;; LCSC Part Name: 厚膜电阻 3.3kΩ ±1%; Supplier Part: C25890; Manufacturer: UNI-ROYAL(厚声); Supplier Footprint: 0402; JLCPCB Part Class: 基础库; Datasheet: https://item.szlcsc.com/datasheet/0402WGF3301TCE/26633.html; Supplier: LCSC; Type: 厚膜电阻; Tolerance: ±1%; Power(Watts): 62.5mW; Voltage-Supply(Max): 50V; Temperature Coefficient: ±100ppm/℃; Operating Temperature: -55℃~+155℃
U22 U24 = ETA6280S2F: 类型:负载开关;通道数:1;输入控制逻辑:高电平有效;工作电压:2.1V~6V;最大连续电流:2.2A;导通电阻:70mΩ;; LCSC Part Name: 可编程电流限制负载开关; Supplier Part: C7465543; Manufacturer: ETA(钰泰); Supplier Footprint: SOT23-5; JLCPCB Part Class: 扩展库; Datasheet: https://item.szlcsc.com/datasheet/ETA6280S2F/8507080.html; Supplier: LCSC; Type: 负载开关; Number of Channels: 1; Control Input Logic: 高电平有效; Voltage - Supply: 2.1V~6V; Maximum Continuous Current: 2.2A; RDS(on): 70mΩ; Features: 过温保护；过流保护；短路保护；反向电流阻断；输出放电功能；过压保护；欠压锁定; Operating Temperature	-: -40℃~+85℃
U23 = CH334H: CH334和CH335是符合USB2.0协议规范的4端口USBHUB控制器芯片，支持高性能的MTT模式。; LCSC Part Name: 丝印前5位：31312 31313 4端口USB HUB控制器芯片，支持USB2.0协议，多模式工作; Supplier Part: C3034270; Manufacturer: WCH(南京沁恒); Supplier Footprint: QFN-28-EP(5x5); JLCPCB Part Class: 扩展库; Datasheet: https://item.szlcsc.com/datasheet/CH334H/3578620.html; Supplier: LCSC; type: 集线器; USB Protocol: USB 2.0; Data Rate: 480Mbps; Voltage - Supply: 5V；3.3V; Operating Temperature: -40℃~+85℃; Memory Interface: I2C; Current - Supply: 85mA; Quiescent Supply Current: 0.4mA; Number of Channels: 4; Features: 端口状态监测；内部稳压器；端口电源开关控制；ESD保护；低功耗模式；上电复位；过流保护
USB2 = TYPE-C 16PIN 2MD(073): 连接器类型:Type-C;协议标准:-;公母:母;安装方式:卧贴;触点数量:16P;端口数量:1;额定电流 - 电源:3A;工作温度:-25℃~+85℃;; LCSC Part Name: Type-C 母 卧贴; Supplier Part: C2765186; Manufacturer: SHOU HAN(首韩); Supplier Footprint: SMD; JLCPCB Part Class: 扩展库; Datasheet: https://item.szlcsc.com/datasheet/TYPE-C%252016PIN%25202MD(073)/2901843.html; Supplier: LCSC; Connector Type: Type-C; Gender: 母; Mounting Type: 卧贴; Number of Contacts: 16P; Number of Ports: 1; Current Rating-Power: 3A; Voltage Rating: 5V; Connect-Disconnect Life: 1万次; Length: 7.35mm; Detection color: 黑色; Operating Temperature: -25℃~+85℃
USB3 = AF SS-JB17.6: 连接器类型:Type-A;协议标准:USB 2.0;公母:母;安装方式:弯插;触点数量:4Px2;端口数量:2;额定电流 - 电源:1A;工作温度:-25℃~+85℃;; LCSC Part Name: Type-A 母 弯插; Supplier Part: C456021; Manufacturer: SHOU HAN(首韩); Supplier Footprint: 弯插; JLCPCB Part Class: 扩展库; Datasheet: https://item.szlcsc.com/datasheet/AF%2520SS-JB17.6/458828.html; Supplier: LCSC; Connector Type: Type-A; Protocol Standard: USB 2.0; Gender: 母; Mounting Type: 弯插; Number of Contacts: 4Px2; Number of Ports: 2; Current Rating-Power: 1A; Voltage Rating: 30V; Connect-Disconnect Life: 5千次; Length: 17.6mm; Detection color: 白色; Operating Temperature: -25℃~+85℃
X3 = X322512MSB4SI: 晶振类型:贴片晶振;频率:12MHz;常温频差:±10ppm;负载电容:20pF;频率稳定度:±20ppm;; LCSC Part Name: YSX321SL 12MHZ 4P 3225 20PF ±10PPM -40~85℃ (±20PPM); Supplier Part: C9002; Manufacturer: YXC(扬兴晶振); Supplier Footprint: SMD3225-4P; JLCPCB Part Class: 基础库; Datasheet: https://item.szlcsc.com/datasheet/X322512MSB4SI/9522.html; Supplier: LCSC; Type: 贴片晶振; Normal temperature Frequency Tolerance: ±10ppm; Load Capacitance: 20pF; Frequency Stability: ±20ppm; Equivalent Series Resistance(ESR): 80Ω; Operating Temperature: -40℃~+85℃

## Nets
AVDD33_HUB: C82.2 R119.1 U23.14(VDD33)
GND: C51.2 C53.1 C54.1 C55.1 C56.1 C57.1 C58.1 C59.1 C60.1 C61.1 C62.1 C63.1 C64.1 C65.1 C66.1 C67.1 C72.1 C73.1 C74.2 C75.1 C76.1 C77.1 C79.1 C80.1 C82.1 C83.1 C84.2 C85.2 C86.2 C87.1 C88.2 C92.2 C94.2 C96.2 C97.1 C99.2 C100.2 C101.2 C102.1 C103.1 C133.1 C134.1 CN1.2 CN2.4 CN3.4 CN4.2 CN5.2 CN6.2 CN7.3 CN7.4 D2.3 D3.3 D4.3 D6.3 D7.3 D9.3 FPC1.4 FPC1.6 FPC1.8 FPC1.10 FPC1.13 FPC1.16 FPC1.19 FPC1.20 FPC1.21 FPC1.22 FPC1.23 FPC1.24 FPC1.30 FPC1.31 FPC1.32 Q1.2(S) Q2.2(S) Q3.2(S) R71.2 R81.2 R87.1 R89.1 R90.1 R106.1 R111.1 R114.1 R125.1 R128.1 U8.15(GND) U9.2(GND) U9.5(VIO) U10.5(GND) U11.2(GND) U11.5(VIO) U12.5(GND) U13.8(GND) U15.8(GND) U16.2(GND) U21.3(GND) U21.8(GND) U22.2(GND) U23.29(EP) U24.2(GND) U25.3(GND) U25.8(GND) U28.12 U28.19 U28.30 U28.37 U36.3 U36.4 U37.3(GND) U37.8(GND) U38.7(GND) USB2.13(EH) USB2.14(EH) USB2.A1B12(GND) USB2.B1A12(GND) USB3.4(GND) USB3.8(GND) X3.2(GND) X3.4(GND) ; also on sheet 3 4 5 11 12
PGND: USB3.9(SHELL) USB3.10(SHELL) USB3.11(SHELL) USB3.12(SHELL) ; also on sheet 5
VCC: C64.2 C65.2 L4.1 U16.6(IN)
VCC3V3: C51.1 C61.2 C62.2 C79.2 CN2.1 CN3.1 FPC1.7 FPC1.9 FPC1.29 R70.2 R80.2 R86.2 R112.2 R115.1 R124.2 U8.16(VCC) U28.40 ; also on sheet 3 4 5 11 12
VCC5V: C53.2 C54.2 C56.2 C57.2 C58.2 C60.2 R131.2 U9.3(VCC) U9.8(S) U10.8(VCC) U11.3(VCC) U11.8(S) U12.8(VCC) U28.39 ; also on sheet 3
VCC5V_PA: C96.1 C97.2 C100.1 C101.1 R131.1 U38.6(VCC)
VCC5V_SYS: C72.2 C85.1 R105.1 U22.5(IN) U24.5(IN) ; also on sheet 3 4 11
VCC5V_USB_HOST: C84.1 C86.1 C87.2 U24.1(OUT) USB3.1(VCC) USB3.5(VCC)
VCC_1V8_OUT: R110.1 R126.1 ; also on sheet 4 11 12
VCC_LEDA: C66.2 C67.2 D10.1(C) FPC1.3 U16.5(OVP)
VCC_LEDK: FPC1.1 FPC1.2 R88.1 R89.2 R90.2
VDD33_HUB: C77.2 C80.2 C133.2 C134.2 R115.2 R116.2 R117.1 R118.1 R119.2 U23.21(VDD33) U23.27(V5) U23.28(VDD33)
A1: CN4.4 D6.2 R74.2
A2: CN6.4 D9.2 R84.2
ACODEC_ADC_INN: C91.2 ; also on sheet 4
ACODEC_ADC_INP: C89.2 ; also on sheet 4
B1: CN4.3 D6.1 R72.2
B2: CN6.3 D9.1 R82.2
CAN0_RX: U9.4(RXD) U28.20 U30.5(I/O) U30.6(NC) ; also on sheet 4
CAN0_TX: U9.1(TXD) U28.18 U30.4(I/O) U30.7(NC) ; also on sheet 4
CAN1_RX: U11.4(RXD) ; also on sheet 4
CAN1_TX: U11.1(TXD) ; also on sheet 4
DSM_AUD_RN: R132.1 U28.24 U32.2(I/O) U32.9(NC)
DSM_AUD_RP: R129.1 U28.26 U32.4(I/O) U32.7(NC)
GPIO1_A0: U27.1(I/O) U27.10(NC) U28.4 ; also on sheet 4
GPIO1_A1: U27.2(I/O) U27.9(NC) U28.6 ; also on sheet 4
GPIO1_A2: U27.4(I/O) U27.7(NC) U28.8 ; also on sheet 4
GPIO1_A3: U27.5(I/O) U27.6(NC) U28.10 ; also on sheet 4
GPIO1_A4: U28.11 U29.1(I/O) U29.10(NC) ; also on sheet 4
GPIO1_A5: U28.13 U29.2(I/O) U29.9(NC) ; also on sheet 4
GPIO1_A6: U28.15 U29.4(I/O) U29.7(NC) ; also on sheet 4
GPIO1_A7: U28.17 U29.5(I/O) U29.6(NC) ; also on sheet 4
GPIO1_B0: U28.14 U30.1(I/O) U30.10(NC) ; also on sheet 4
GPIO1_B4: U28.21 U31.1(I/O) U31.10(NC) ; also on sheet 4
GPIO1_B5: U28.23 U31.2(I/O) U31.9(NC) ; also on sheet 4
GPIO1_B6: U28.25 U31.4(I/O) U31.7(NC) ; also on sheet 4
GPIO1_B7: U28.27 U31.5(I/O) U31.6(NC) ; also on sheet 4
GPIO1_C0: U28.22 U32.1(I/O) U32.10(NC) ; also on sheet 4
GPIO1_C4: U28.29 U33.1(I/O) U33.10(NC) ; also on sheet 4
GPIO1_C5: U28.31 U33.2(I/O) U33.9(NC) ; also on sheet 4
GPIO1_C6: U28.33 U33.4(I/O) U33.7(NC) ; also on sheet 4
GPIO1_C7: U28.35 U33.5(I/O) U33.6(NC) ; also on sheet 4
GPIO1_D0: U28.32 U35.1(I/O) U35.10(NC) ; also on sheet 4
H1: CN1.3 D4.1 R66.2 R69.2
H2: CN5.3 D7.1 R76.2 R79.2
HUB_DM1: U23.3(DM1) ; also on sheet 11
HUB_DM2: U23.6(DM2) ; also on sheet 11
HUB_DM3: R122.1 U23.12(DM3)
HUB_DM4: R120.1 U23.15(DM4)
HUB_DMU: U23.1(DMU)
HUB_DP1: U23.4(DP1) ; also on sheet 11
HUB_DP2: U23.7(DP2) ; also on sheet 11
HUB_DP3: R123.1 U23.13(DP3)
HUB_DP4: R121.1 U23.16(DP4)
HUB_DPU: U23.2(DPU)
I2C_SCL: FPC1.27 U14.2(I/O) U14.9(NC) U26.4(I/O) U26.7(NC) U28.7 ; also on sheet 4 11
I2C_SDA: FPC1.26 U14.4(I/O) U14.7(NC) U26.5(I/O) U26.6(NC) U28.9 ; also on sheet 4 11
L1: CN1.4 D4.2 R67.2 R68.2
L2: CN5.4 D7.2 R77.2 R78.2
LCD_PWM: R87.2 U16.4(EN/PWM) U28.1 U34.5(I/O) U34.6(NC) ; also on sheet 4
LCD_PWREN: U28.2 U34.4(I/O) U34.7(NC) ; also on sheet 4
MIPI_DSI_CLKN: FPC1.18 U15.2(I/O) U15.9(NC)
MIPI_DSI_CLKP: FPC1.17 U15.1(I/O) U15.10(NC)
MIPI_DSI_D0N: FPC1.12 U13.2(I/O) U13.9(NC)
MIPI_DSI_D0P: FPC1.11 U13.1(I/O) U13.10(NC)
MIPI_DSI_D1N: FPC1.15 U13.5(I/O) U13.6(NC)
MIPI_DSI_D1P: FPC1.14 U13.4(I/O) U13.7(NC)
MIPI_RST: C63.2 FPC1.5 R86.1
OTG_CC1: D12.1(C) U21.1(I/O) U21.10(NC) USB2.A5(CC1)
OTG_CC2: D13.1(C) U21.5(I/O) U21.6(NC)
OTG_DN: R108.1 U21.4(I/O) U21.7(NC) USB2.A7(Dn1) USB2.B7(Dn2)
OTG_DP: R109.1 U21.2(I/O) U21.9(NC) USB2.A6(Dp1) USB2.B6(Dp2)
OTG_VBSU: USB2.B4A9(VBUS)
OTG_VBUS: C73.2 C74.1 R107.1 U22.1(OUT) USB2.A4B9(VBUS)
RS232_RX1: CN3.2 D2.1 R61.2
RS232_RX2: CN2.2 D3.2 R65.1
RS232_TX1: CN3.3 D2.2 R60.2
RS232_TX2: CN2.3 D3.1 R63.1
SPK_CTRL: U38.1(CTRL) ; also on sheet 4
TP_INT: FPC1.25 U14.5(I/O) U14.6(NC) U26.2(I/O) U26.9(NC) U28.5 ; also on sheet 4
TP_RST: FPC1.28 U14.1(I/O) U14.10(NC) U26.1(I/O) U26.10(NC) U28.3 ; also on sheet 4
UART1_RX: R62.2 ; also on sheet 4
UART1_TX: R64.2 U8.9(ROUT2) ; also on sheet 4
UART2_RX: U8.10(DIN2) U28.28 U32.5(I/O) U32.6(NC) ; also on sheet 4
UART2_TX: U28.16 U30.2(I/O) U30.9(NC) ; also on sheet 4
UART3_RTSN: U10.2(RE#) U10.3(DE) ; also on sheet 4
UART3_RX: D5.2(A) R70.1 ; also on sheet 4
UART3_TX: R73.1 ; also on sheet 4
UART4_RTSN: U12.2(RE#) U12.3(DE) U28.34 U35.2(I/O) U35.9(NC) ; also on sheet 4
UART4_RX: D8.2(A) R80.1 U28.36 U35.4(I/O) U35.7(NC) ; also on sheet 4
UART4_TX: R83.1 U28.38 U35.5(I/O) U35.6(NC) ; also on sheet 4
USB20_OTG0_DM: R108.2 ; also on sheet 4
USB20_OTG0_DP: R109.2 ; also on sheet 4
USB20_OTG0_ID: Q1.1(G) Q2.3(D) ; also on sheet 4
USB20_OTG0_VBUSDET: C75.2 R107.2 R111.2 ; also on sheet 4
$6N338: C49.2 U8.1(C1+)
$6N379: C50.2 U8.2(V+)
$6N457: R62.1 U8.12(ROUT1)
$6N461: R64.1 U8.11(DIN1)
$6N644: R60.1 U8.14(DOUT1)
$6N646: R61.1 U8.13(RIN1)
$6N743: R63.2 U8.7(DOUT2)
$6N746: R65.2 U8.8(RIN2)
$6N795: C49.1 U8.3(C1–)
$6N841: C50.1 U8.6(V-)
$6N885: C52.2 U8.4(C2+)
$6N889: C52.1 U8.5(C2–)
$6N2068: R71.1 R72.1 U10.7(B)
$6N2196: R74.1 R75.2 U10.6(A)
$6N2660: R73.2 U10.4(DI)
$6N2751: D5.1(C) U10.1(RO)
$6N3392: R81.1 R82.1 U12.7(B)
$6N3399: R84.1 R85.2 U12.6(A)
$6N3421: R83.2 U12.4(DI)
$6N3426: D8.1(C) U12.1(RO)
$6N4080: R66.1 U9.7(CANH)
$6N4087: R67.1 U9.6(CANL)
$6N4284: C55.2 R68.1 R69.1
$6N4959: R76.1 U11.7(CANH)
$6N4961: R77.1 U11.6(CANL)
$6N5000: C59.2 R78.1 R79.1
$7N2428: D10.2(A) L4.2 U16.1(SW)
$7N2890: R88.2 U16.3(FB)
$8N422: U23.10(XI) X3.3(OSC2)
$8N430: U23.11(XO) X3.1(OSC1)
$8N536: R116.1 U23.19(OVCUR4#) U23.20(OVCUR3#) U23.24(OVCUR2#) U23.25(OVCUR1#)
$8N1360: C83.2 R118.2 U23.17(RESET#/CDP)
$8N1554: R117.2 U23.22(PSELF)
$8N2590: R120.2 U25.6(NC) USB3.2(D-)
$8N2595: R121.2 U25.7(NC) USB3.3(D+)
$8N2862: R124.1 U24.4(EN)
$8N2878: R125.2 U24.3(ILIM)
$8N3622: R123.2 U25.10(NC) USB3.7(D+)
$8N3681: R122.2 U25.9(NC) USB3.6(D-)
$8N7148: R106.2 U22.3(ILIM)
$8N7549: Q1.3(D) R105.2 U22.4(EN)
$8N7816: D12.2(A) D13.2(A) R112.1 R113.1
$8N8167: C76.2 Q3.1(G) R113.2 R114.2
$8N8424: Q2.1(G) Q3.3(D) R110.2
$10N2487: C89.1 C90.2 R127.1 U36.1 U37.2(I/O)
$10N2527: C90.1 C91.1 R128.2 U36.2 U37.1(I/O)
$10N2901: C88.1 R126.2 R127.2
$10N4910: C94.1 U38.2(Bypass)
$10N4920: C95.1 R133.2 U38.4(INN)
$10N4925: L5.1 U38.8(VoP)
$10N5333: C92.1 C93.1 R129.2
$10N5426: C93.2 R130.1
$10N5650: C98.1 C99.1 R132.2
$10N5656: C98.2 R133.1
$10N5790: C95.2 R130.2 U38.3(INP)
$10N6049: C103.2 CN7.1 L5.2
$10N6126: C102.2 CN7.2 L6.2
$10N6129: L6.1 U38.5(VON)

Not connected (* = marked no-connect by the designer): CN1 1*; CN4 1*; CN5 1*; CN6 1*; R75 1; R85 1; U13 3(GND); U14 3(GND) 8(GND); U15 3(GND) 4(I/O) 5(I/O) 6(NC) 7(NC); U23 5(NC)* 8(PWREN#)* 9(NC)* 18(LED3/SCL)* 23(PGANG)* 26(LED4/SDA)*; U25 1(I/O) 2(I/O) 4(I/O) 5(I/O); U26 3(GND) 8(GND); U27 3(GND) 8(GND); U29 3(GND) 8(GND); U30 3(GND) 8(GND); U31 3(GND) 8(GND); U32 3(GND) 8(GND); U33 3(GND) 8(GND); U34 1(I/O) 2(I/O) 3(GND) 8(GND) 9(NC) 10(NC); U35 3(GND) 8(GND); U37 4(I/O) 5(I/O) 6(NC) 7(NC) 9(NC) 10(NC); USB2 A8(SBU1)* B5(CC2) B8(SBU2)*

## Notes on the sheets
sheet 6
- RS232
- CAN0
- RS485
- CAN1
- RS485
sheet 7
- MIPI LCD
- LCD PWM
sheet 8
- TypeC OTG
- USB HUB
- USB2.0 TYPEA
sheet 9
- GPIO
sheet 10
- MIC 麦克风
- SPK 扬声器
